# EasyEDA Pro project ProPrj_F1底板.1_2025-05-31.epro

# Schematic Schematic1

## Sheets
1 MPU6050: Board Name: Board1; Create Date: 2025-05-13; Page Name: MPU6050; Project Name: F1底板.1; Schematic Name: Schematic1; Update Date: 2025-05-19; Company: 嘉立创EDA; Page Size: A4; Version: V1.0
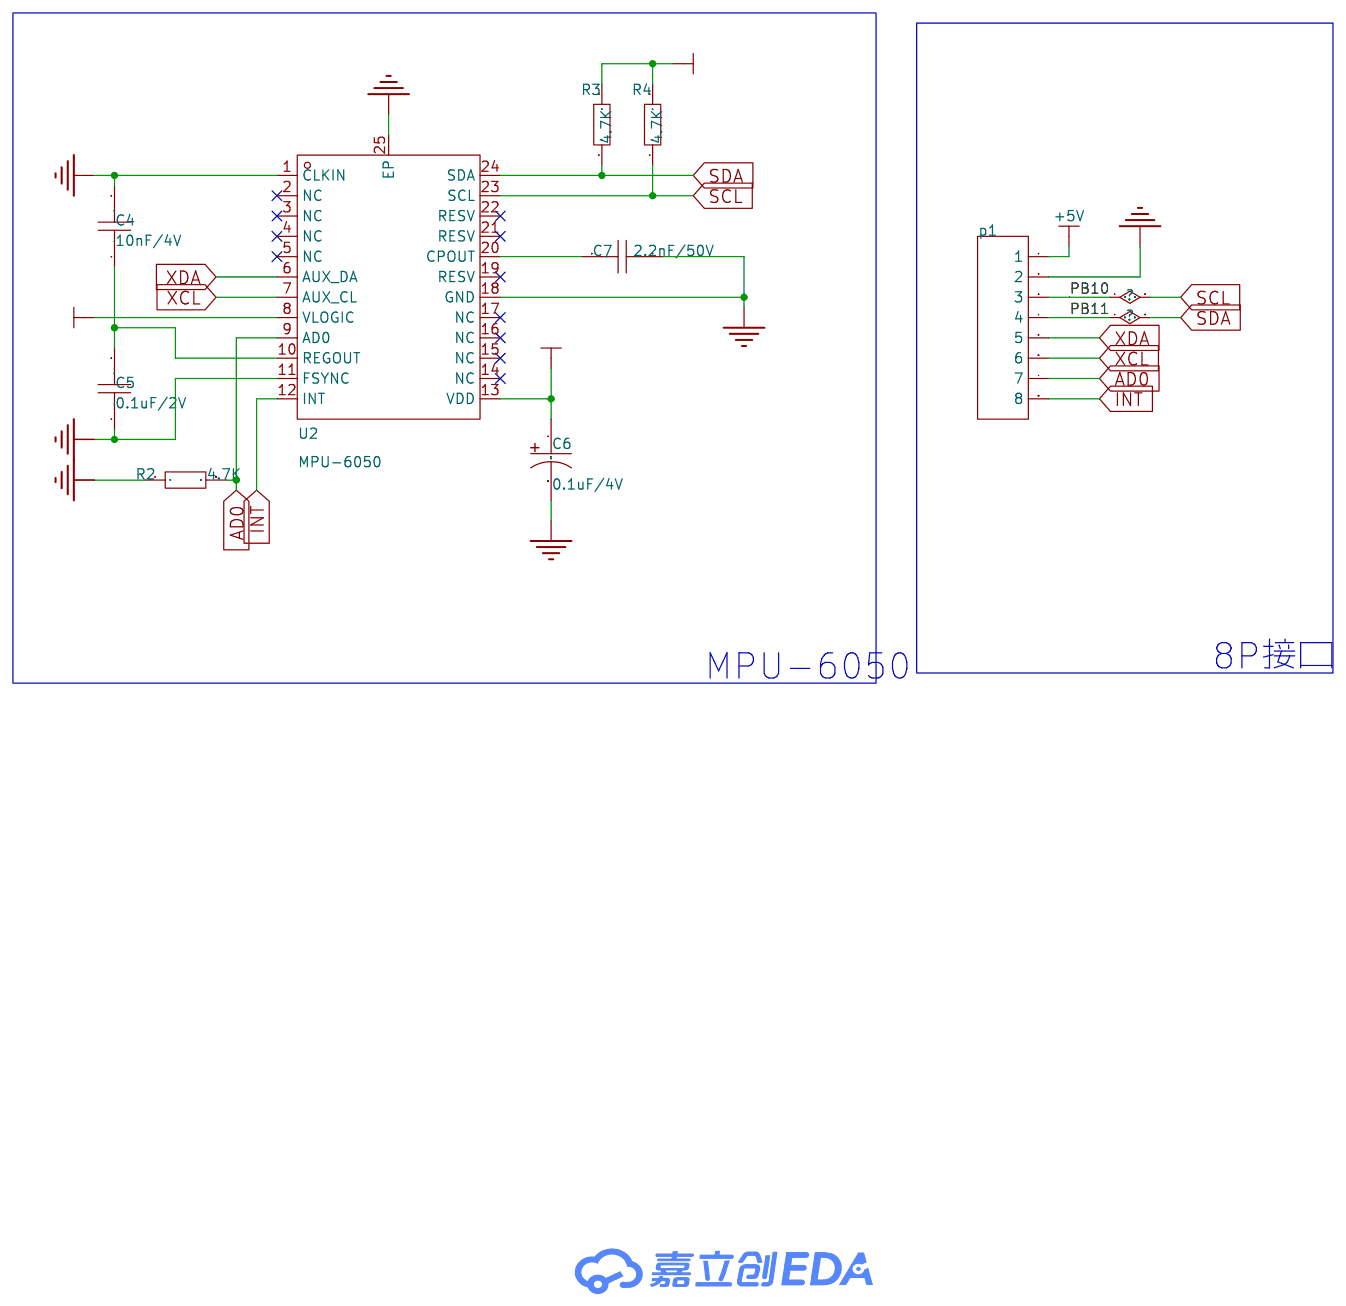
[diagram p0: MPU6050]
2 按键: Page Name: 按键; Update Date: 2025-05-13
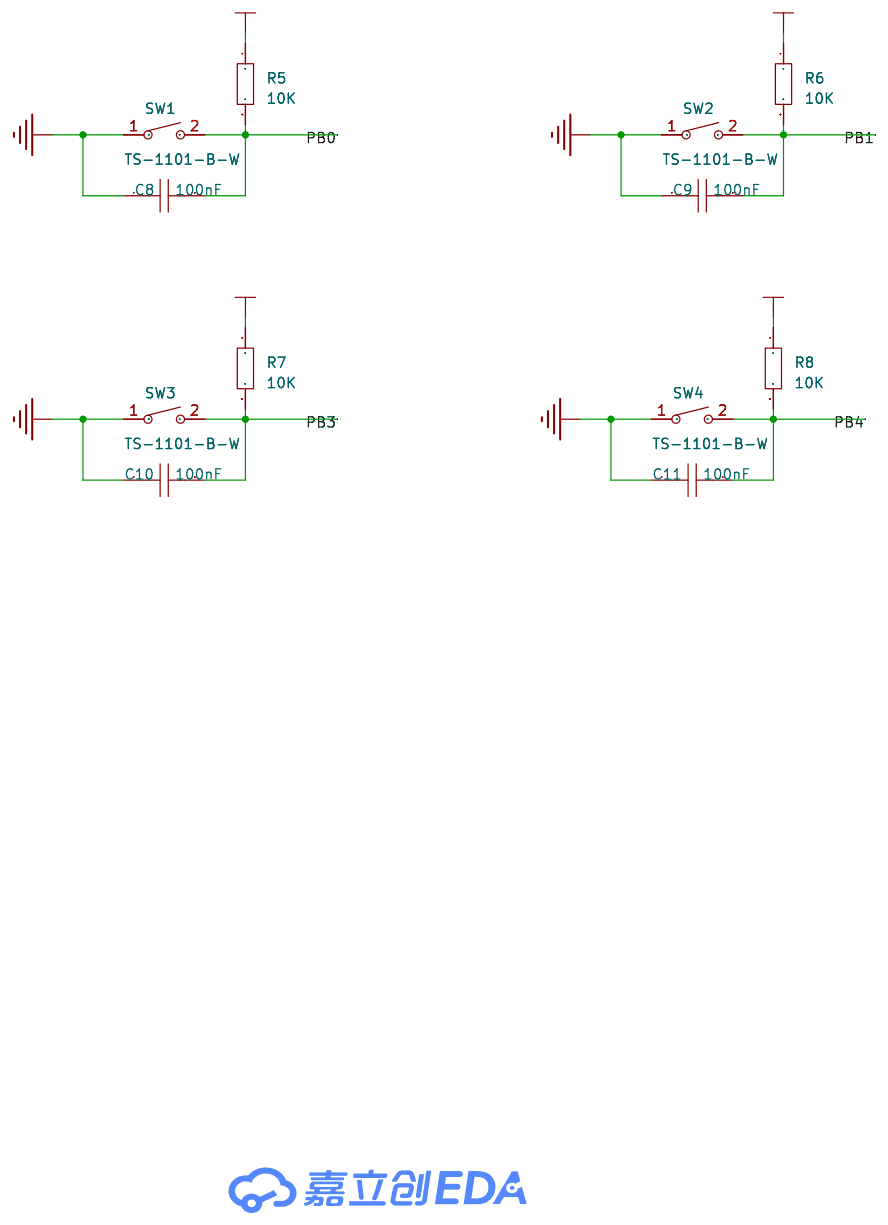
[diagram p1: 按键]
3 蜂鸣器: Page Name: 蜂鸣器; Update Date: 2025-05-13
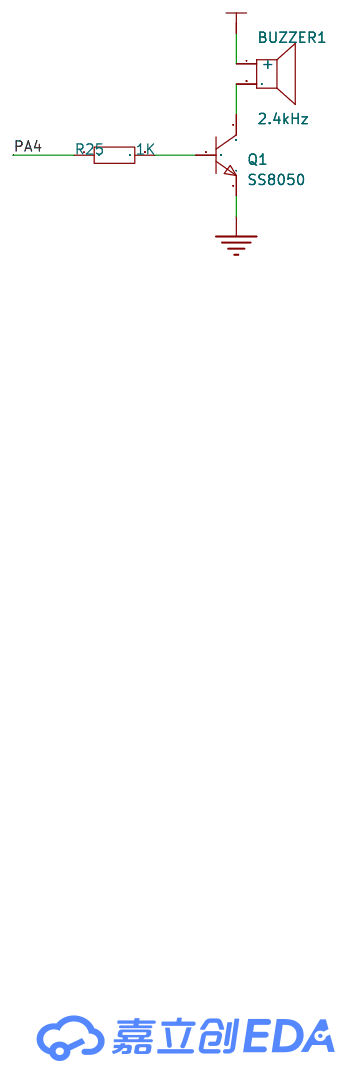
[diagram p2: 蜂鸣器]
4 TB6612驱动模块: Page Name: TB6612驱动模块
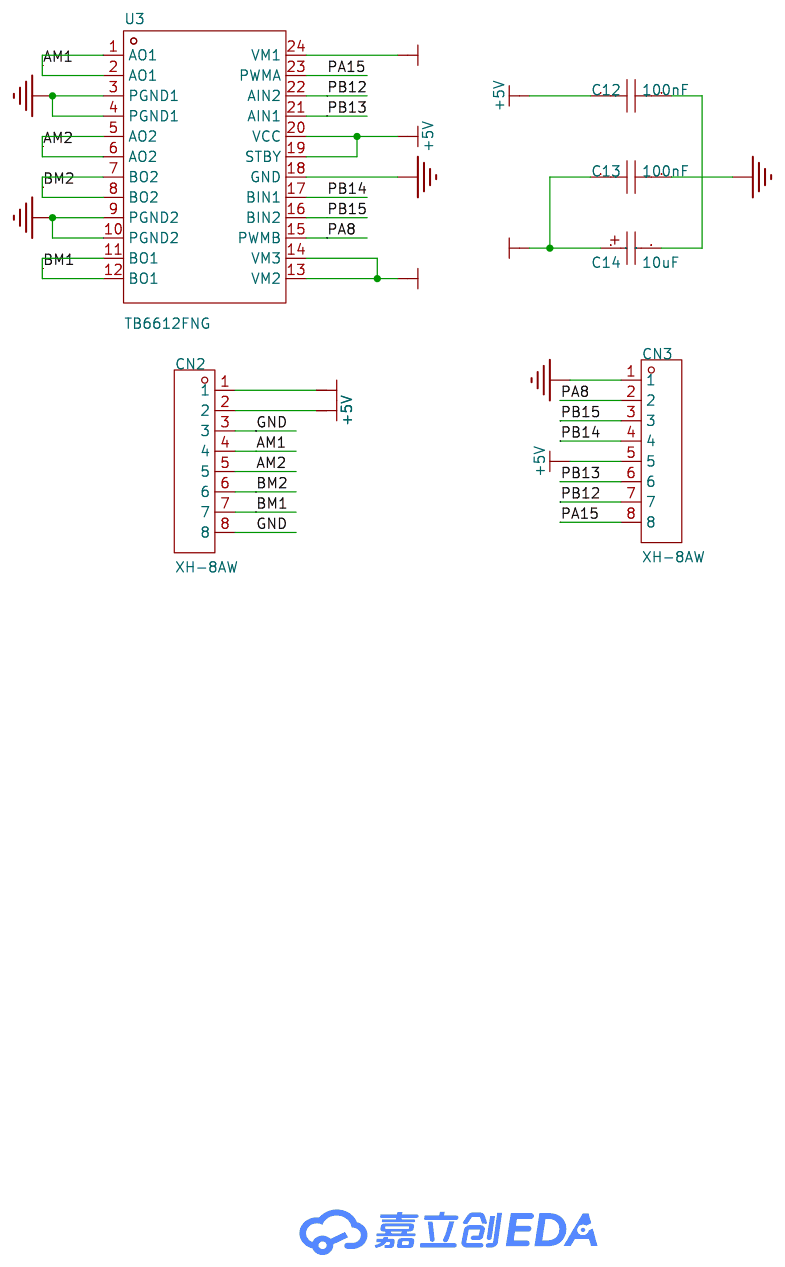
[diagram p3: TB6612驱动模块]
5 接口: Page Name: 接口; Update Date: 2025-05-21
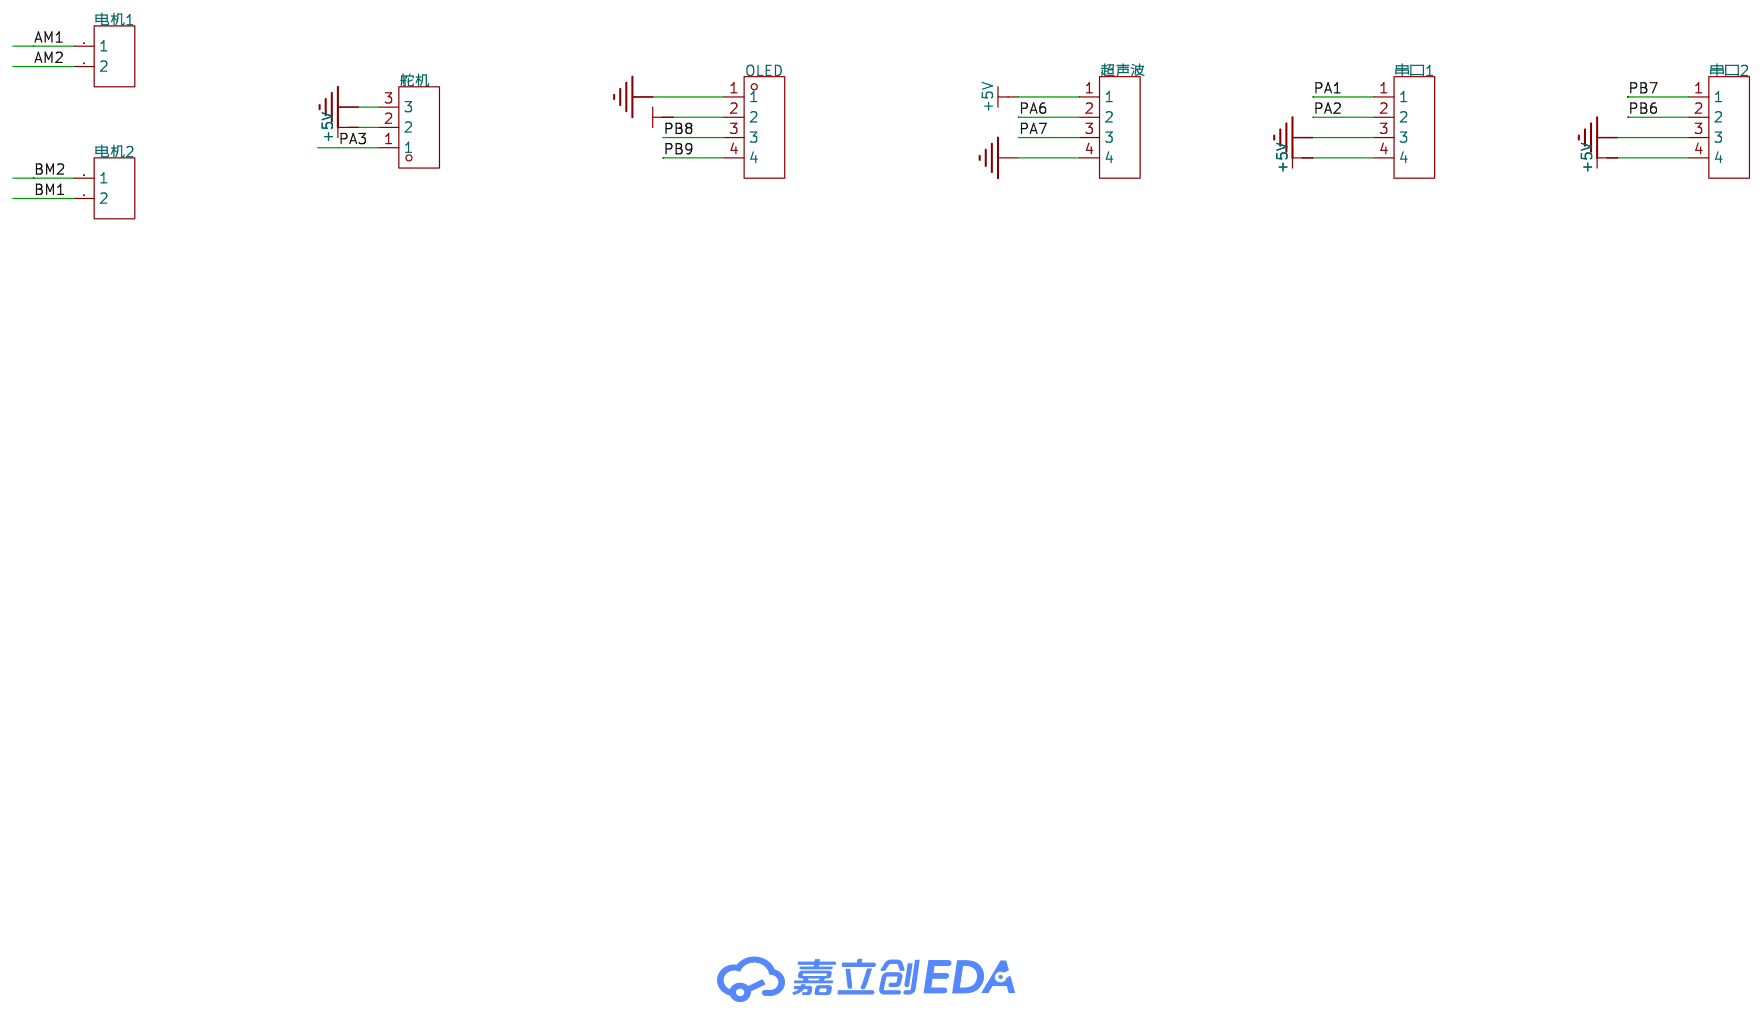
[diagram p4: 接口]
6 电源输入 输出: Page Name: 电源输入 输出
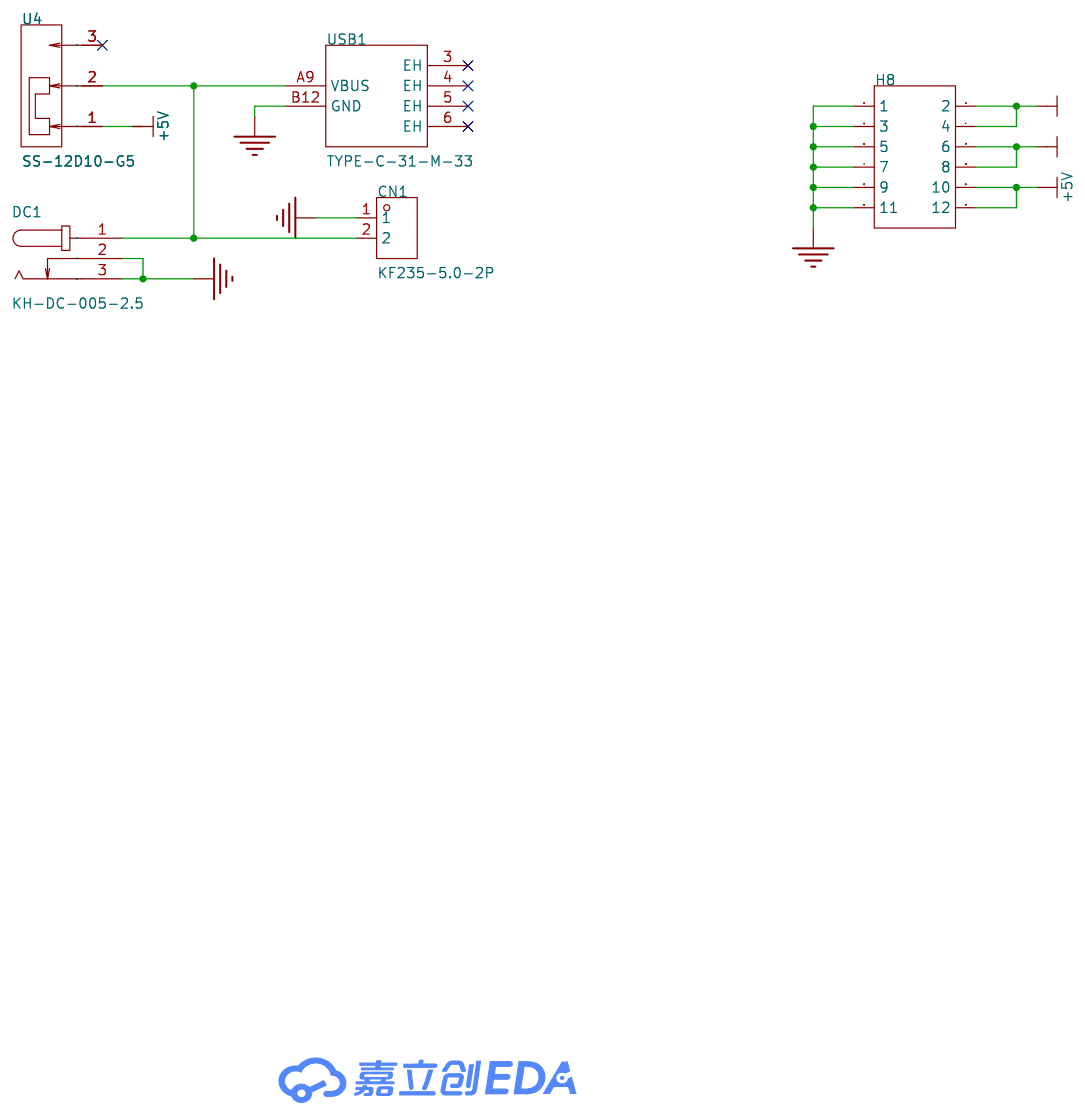
[diagram p5: 电源输入 输出]
7 升压 降压模块: Page Name: 升压 降压模块; Update Date: 2025-05-13
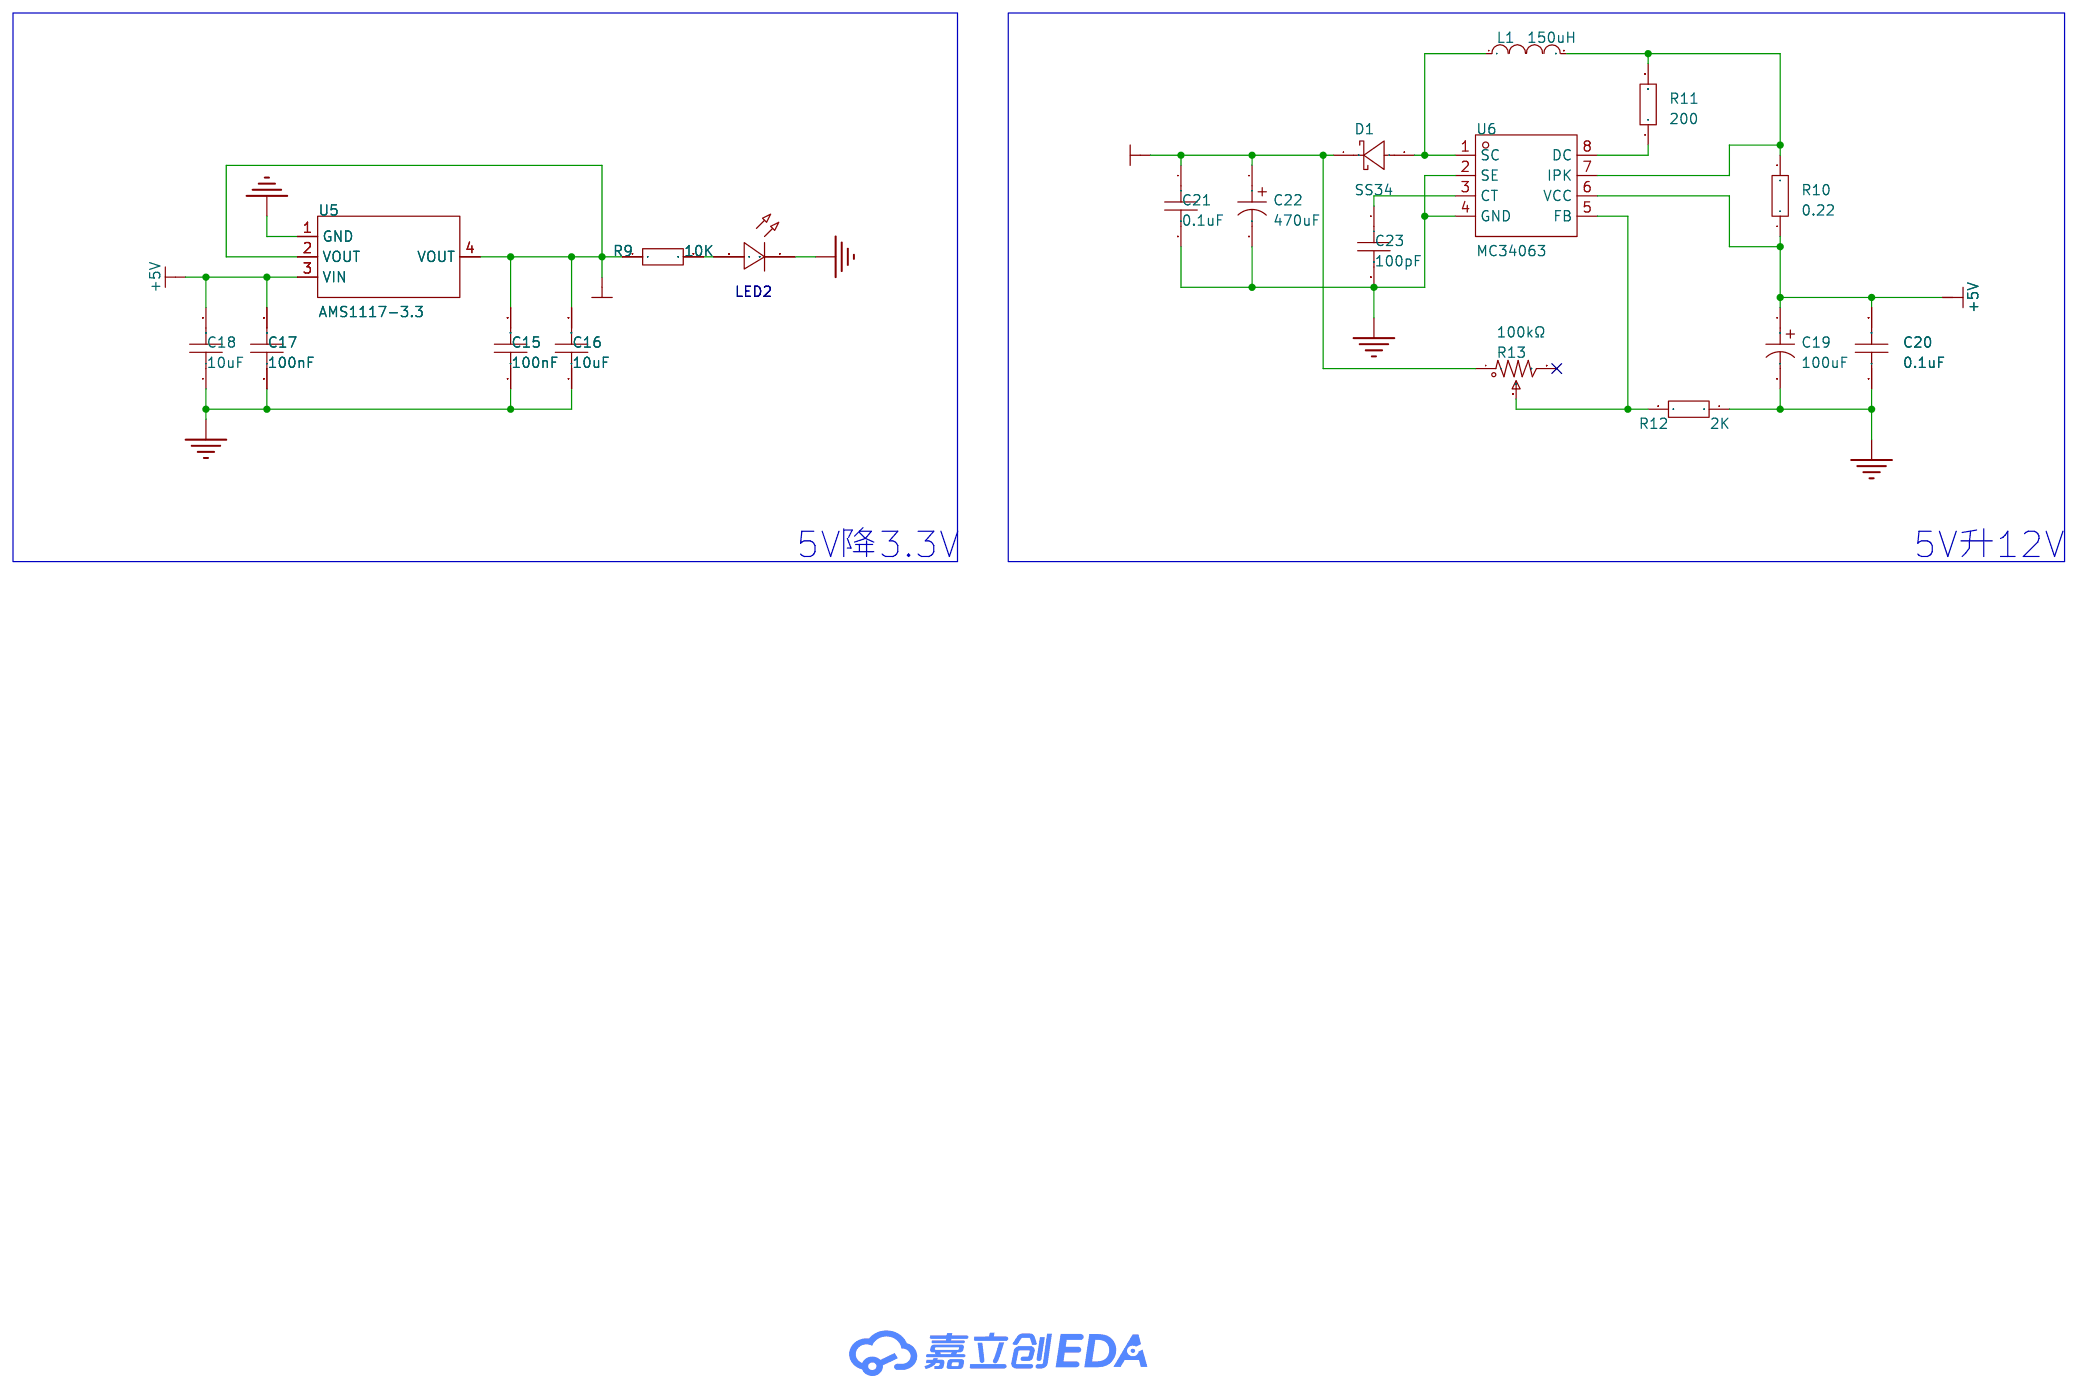
[diagram p6: 升压 降压模块]
8 蓝牙模块: Create Date: 2025-05-15; Page Name: 蓝牙模块; Update Date: 2025-05-15
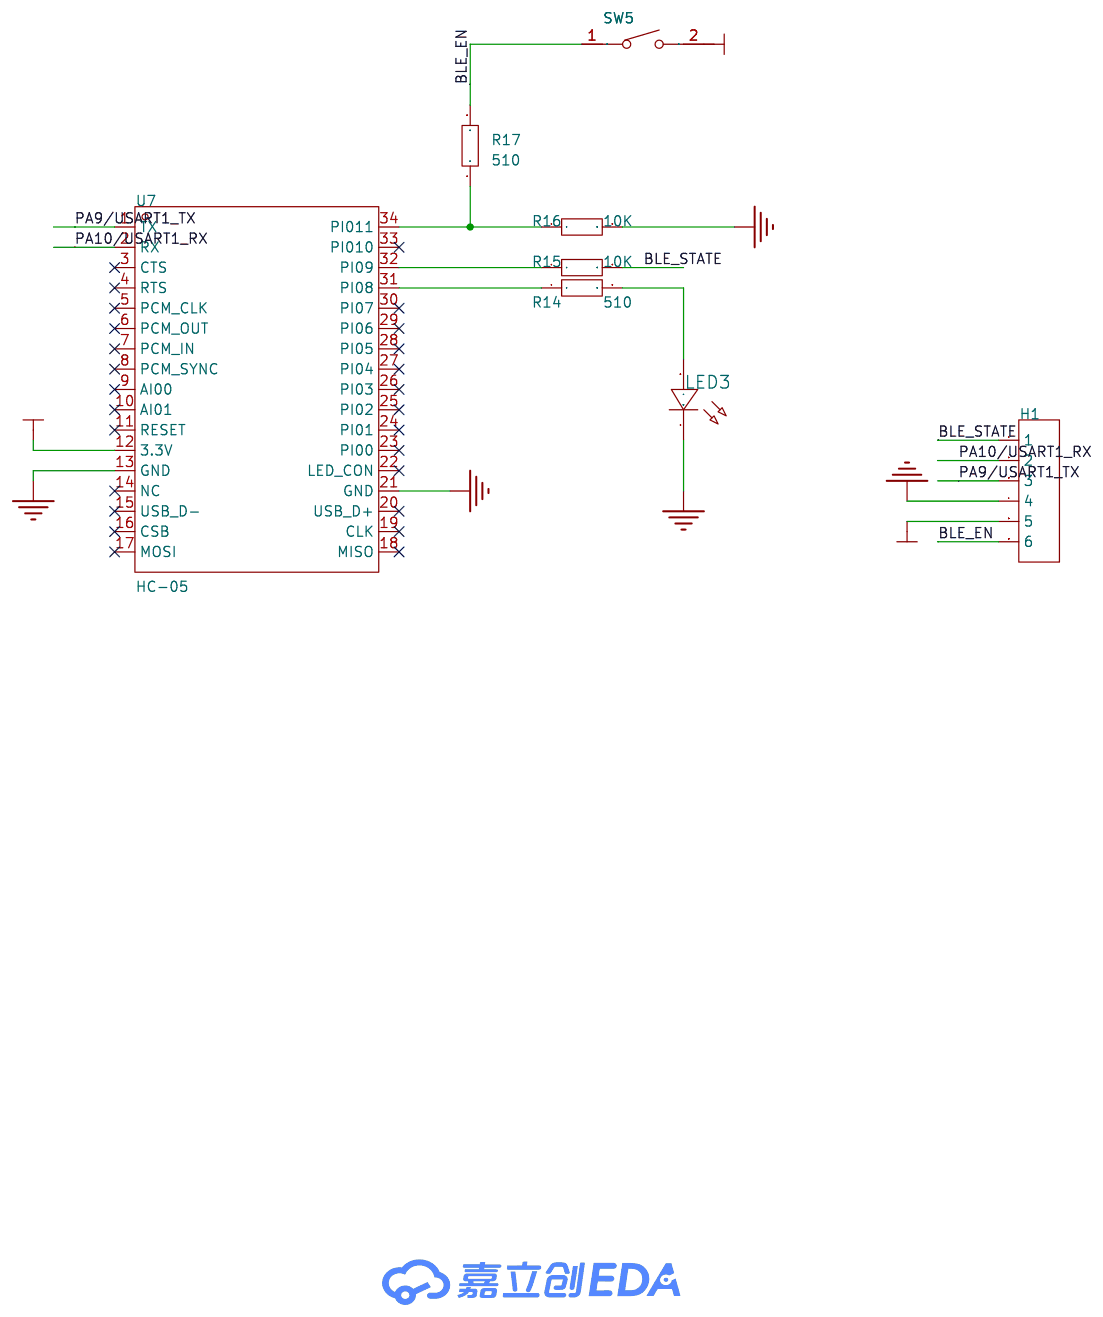
[diagram p7: 蓝牙模块]
9 STM32F103C8T6模块: Create Date: 2025-05-15; Page Name: STM32F103C8T6模块
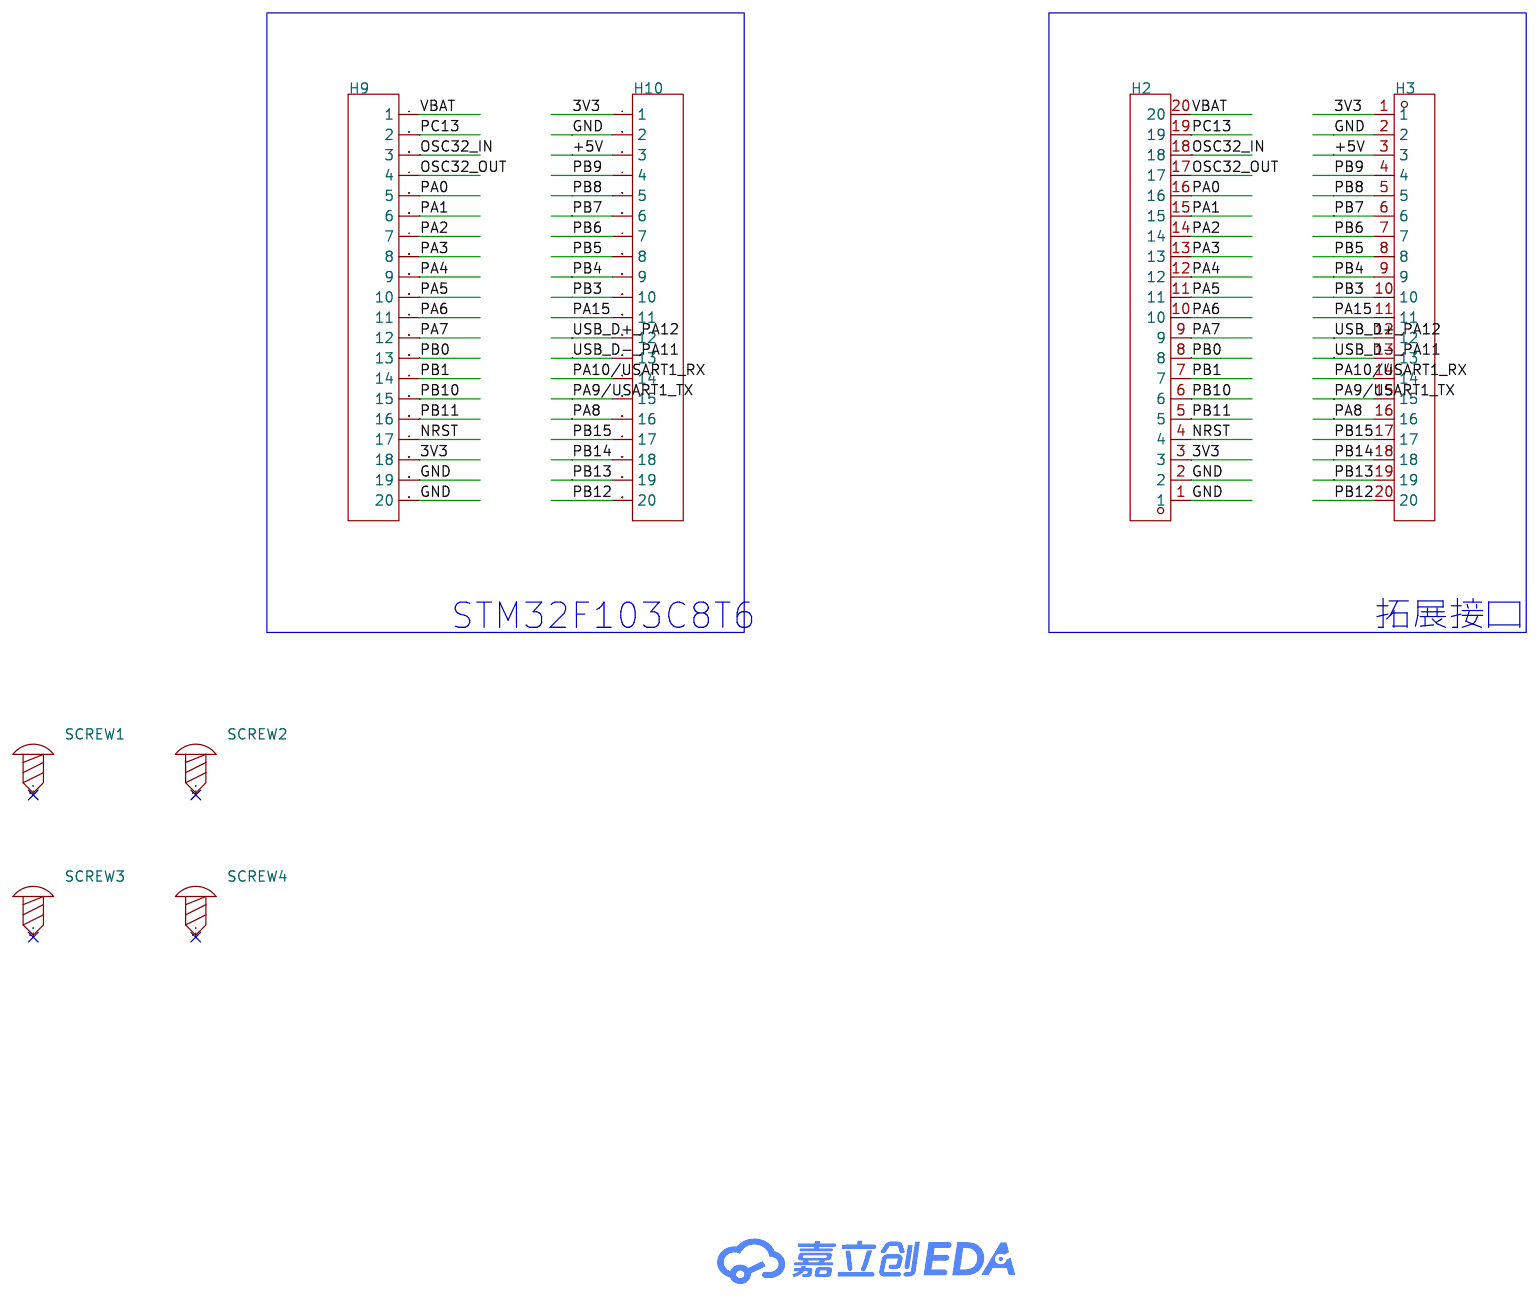
[diagram p8: STM32F103C8T6模块]
10 光敏: Create Date: 2025-05-15; Page Name: 光敏; Update Date: 2025-05-15
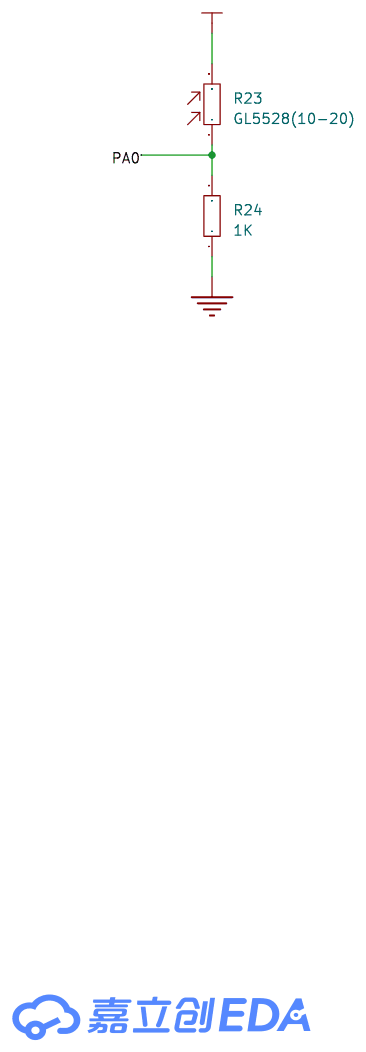
[diagram p9: 光敏]

## Parts
sheet MPU6050
C4  10nF/4V  [C0805]
C5  0.1uF/2V  [C0805]
C6  0.1uF/4V  [CAP-SMD_L3.2-W1.6]
C7  2.2nF/50V  [C0805]
p1  -  [HDR-TH_8P-P2.54-V-M]
R2  4.7K  [R0805]
R3  4.7K  [R0805]
R4  4.7K  [R0805]
U2  MPU-6050  [QFN-24_L4.0-W4.0-P0.50-BL-EP2.7]
sheet STM32F103C8T6模块
H2  -  [HDR-TH_20P-P2.54-V-M-1]
H3  -  [HDR-TH_20P-P2.54-V-M-1]
H9  -  [HDR-TH_20P-P2.54-V-F]
H10  -  [HDR-TH_20P-P2.54-V-F]
SCREW1  -  [M3螺丝]
SCREW2  -  [M3螺丝]
SCREW3  -  [M3螺丝]
SCREW4  -  [M3螺丝]
sheet TB6612驱动模块
C12  100nF  [C0805]
C13  100nF  [C0805]
C14  10uF  [CAP-SMD_L3.5-W2.8-R-RD]
CN2  XH-8AW  [CONN-TH_8P-P2.54_HCTL_XH-8AW_C2908617]
CN3  XH-8AW  [CONN-TH_8P-P2.54_HCTL_XH-8AW_C2908617]
U3  TB6612FNG  [SSOP-24_L8.3-W5.6-P0.65-LS7.6-BL]
sheet 光敏
R23  GL5528(10-20)  [RES-TH_L5.1-W4.3-P3.40-D0.5]
R24  1K  [R0805]
sheet 升压 降压模块
C15  100nF  [C0805]
C16  10uF  [C0805]
C17  100nF  [C0805]
C18  10uF  [C0805]
C19  100uF  [CAP-SMD_BD6.3-L6.6-W6.6-LS7.6-RD]
C20  0.1uF  [C0805]
C21  0.1uF  [C0805]
C22  470uF  [CAP-SMD_BD6.3-L6.6-W6.6-LS7.6-RD]
C23  100pF  [C0805]
D1  SS34  [SMA_L4.3-W2.5-LS5.0-RD]
L1  150uH  [IND-SMD_L7.0-W6.8]
LED2  -  [LED_0805]
R9  10K  [R0805]
R10  0.22  [R0805]
R11  200  [R0805]
R12  2K  [R0805]
R13  100kΩ  [RES-ADJ-TH_3P-L10.0-W10.0-P2.50-L]
U5  AMS1117-3.3  [SOT-223-3_L6.5-W3.4-P2.30-LS7.0-BR]
U6  MC34063  [SOIC-8_L5.0-W4.0-P1.27-LS6.0-BL]
sheet 按键
C8  100nF  [C0805]
C9  100nF  [C0805]
C10  100nF  [C0805]
C11  100nF  [C0805]
R5  10K  [R0805]
R6  10K  [R0805]
R7  10K  [R0805]
R8  10K  [R0805]
SW1  TS-1101-B-W  [KEY-SMD_2P-L6.0-W3.6-P7.4-LS8.0-L]
SW2  TS-1101-B-W  [KEY-SMD_2P-L6.0-W3.6-P7.4-LS8.0-L]
SW3  TS-1101-B-W  [KEY-SMD_2P-L6.0-W3.6-P7.4-LS8.0-L]
SW4  TS-1101-B-W  [KEY-SMD_2P-L6.0-W3.6-P7.4-LS8.0-L]
sheet 接口
OLED  -  [HDR-TH_4P-P2.54-V-F]
串口1  -  [HDR-TH_4P-P2.54-V-M]
串口2  -  [HDR-TH_4P-P2.54-V-M]
电机1  -  [HDR-TH_2P-P2.54-V-F]
电机2  -  [HDR-TH_2P-P2.54-V-F]
舵机  -  [HDR-TH_3P-P2.54-V-M]
超声波  -  [HDR-TH_4P-P2.54-V-M]
sheet 电源输入 输出
CN1  KF235-5.0-2P  [CONN-TH_P5.00_KF235-5.0-2P]
DC1  KH-DC-005-2.5  [DC-IN-TH_KH-DC-005-2.5]
H8  -  [HDR-TH_12P-P2.54-V-M-R2-C6-S2.54]
U4  SS-12D10-G5  [SW-TH_SS-12D10-G050]
USB1  TYPE-C-31-M-33  [USB-C-TH_TYPE-C-31-M-33]
sheet 蓝牙模块
H1  -  [HDR-TH_6P-P2.54-V-M-1]
LED3  -  [LED_0805]
R14  510  [R0805]
R15  10K  [R0805]
R16  10K  [R0805]
R17  510  [R0805]
SW5  TS-1088-AR02016  [SW-SMD_L3.9-W3.0-P4.45]
U7  HC-05  [BULETM-SMD_HC-05]
sheet 蜂鸣器
BUZZER1  2.4kHz  [BUZ-TH_BD12.0-P7.60-D0.6-FD]
Q1  SS8050  [SOT-23-3_L2.9-W1.3-P1.90-LS2.4-BR]
R25  1K  [R0805]

## Library data of the parts
C4 C5 C7-C13 C15-C18 C20 C21 C23 = CAP_0805: Supplier Footprint: 0805
C6 = TPSA106K016R1000: 容值:10uF;精度:±10%;额定电压:16V;等效串联电阻:1Ω@100kHz;; LCSC Part Name: 10uF ±10% 16V; Supplier Part: C282116; Manufacturer: Kyocera AVX; Supplier Footprint: CASE-A-3216-18(mm); Datasheet: https://atta.szlcsc.com/upload/public/pdf/source/20181129/C308928_3E6DA6FC57C95F0966ACBCD944046350.pdf; Supplier: LCSC; Tolerance: ±10%; Rated Voltage: 16V; Equivalent Series Resistance(ESR): 1Ω@100kHz; Operating Temperature: -55℃~+125℃
p1 = HDR-M_2.54_1x8P: Supplier Part: C124381; Supplier Footprint: 插件
R2-R12 R14-R17 R24 R25 = Res_0805: Supplier Footprint: 0805
U2 = MPU-6050: 传感器类型:加速度计陀螺仪;; Supplier Part: C24112; Manufacturer: TDK InvenSense(应美盛); Supplier Footprint: QFN-24-EP(4x4); JLCPCB Part Class: 扩展库; Datasheet: https://atta.szlcsc.com/upload/public/pdf/source/20140425/1457707046159.pdf; Supplier: LCSC; Sensor Type: 加速度计陀螺仪; Operating Temperature: -40℃~+85℃
H2 H3 = HDR-M_2.54_1x20P: 间距:2.54mm;总PIN位数:20;排数:1;插针结构:-;行距:-;安装类型:直插;圆针/方针:-;额定电流:-;额定电压:-;配合针长度:-;塑高:-;触头材质:黄铜;触头镀层:-;颜色:黑色;; Supplier Part: C50981; Supplier Footprint: 插件
H9 H10 = HDR-F_2.54_1x20P: Supplier Part: C50984; Supplier Footprint: 插件
SCREW1-SCREW4 = M3螺丝: Supplier Footprint: 插件
C14 = TAJB106K025RNJ: 容值:10uF;精度:±10%;额定电压:25V;等效串联电阻(ESR):2.5Ω@100kHz;; LCSC Part Name: 10uF ±10% 25V; Supplier Part: C7194; Manufacturer: Kyocera AVX; Supplier Footprint: CASE-B-3528-21(mm); JLCPCB Part Class: 扩展库; Supplier: LCSC; Tolerance: ±10%; Voltage Rating: 25V; Equivalent Series Resistance(ESR): 2.5Ω@100kHz; Operating Temperature: -55℃~+125℃
CN2 CN3 = XH-8AW: 插针结构:1x8P;间距:2.5mm;安装方式:弯插;参考系列:XH;总PIN数:8P;排数:1;每排PIN数:8;行距:-;额定电流:3A;触头材质:黄铜;触头镀层:锡;工作温度范围:-25℃~+85℃;; LCSC Part Name: 1x8P 间距:2.5mm 弯插 系列:XH; Supplier Part: C2908617; Manufacturer: HCTL(华灿天禄); Supplier Footprint: 弯插,P=2.5mm; Datasheet: https://atta.szlcsc.com/upload/public/pdf/source/20230711/B565BAF3B11666EF6B81B3605408F2BD.pdf; Supplier: LCSC; Pins Structure: 1x8P; Pitch: 2.5mm; Mounting Style: 弯插; Reference Series: XH; Number of Pins: 8P; Number of Rows: 1; Number of PINs Per Row: 8; Current Rating (Max): 3A; Contact Material: 黄铜; Contact Plating: 锡; Operating Temperature Range: -25℃~+85℃
U3 = TB6612FNG,C,8,EL: LCSC Part Name: 1A 有刷直流电机驱动芯片 5.5V; Supplier Part: C141517; Manufacturer: TOSHIBA(东芝); Supplier Footprint: SSOP-24; JLCPCB Part Class: 扩展库; Datasheet: https://atta.szlcsc.com/upload/public/pdf/source/20171128/C141517_15118625624231147036.pdf; Supplier: LCSC
R23 = GL5528(10-20)_C10081: 暗电阻:1MΩ;亮电阻@10Lux:10kΩ~20kΩ;光谱峰值(波长):540nm;; Supplier Part: C10081; Manufacturer: JCHL(晶创和立); Supplier Footprint: 插件,P=3.4mm; JLCPCB Part Class: 扩展库; Datasheet: https://atta.szlcsc.com/upload/public/pdf/source/20200417/C515010_C10502EF7F431E893A7F20DB83F527F0.pdf; Supplier: LCSC; Dark Resistance: 1MΩ; Cell Resistance @ Illuminance: 10kΩ~20kΩ; Voltage - Max: 150V; Wavelength - Peak: 540nm
C19 C22 = RVT1C471M0607: 容值:470uF;精度:±20%;额定电压:16V;纹波电流:185mA@120Hz;; LCSC Part Name: 470uF ±20% 16V; Supplier Part: C2977552; Manufacturer: ROQANG(容强); Supplier Footprint: SMD,D6.3xL7.7mm; JLCPCB Part Class: 扩展库; Datasheet: https://atta.szlcsc.com/upload/public/pdf/source/20220223/DD822675CC1DF2F0C06D5C2255C9C2D9.pdf; Supplier: LCSC; Tolerance: ±20%; Voltage Rating: 16V; Ripple Current: 185mA@120Hz; Diameter: 6.3mm; Height - Seated (Max): 7.7mm; Lifetime: 2000hrs@105℃; Operating Temperature: -40℃~+105℃
D1 = SS34_C727060: 二极管配置:独立式;正向压降(Vf):550mV@3A;直流反向耐压(Vr):40V;整流电流:3A;; LCSC Part Name: 电压:40V 电流:3A; Supplier Part: C727060; Manufacturer: TWGMC(台湾迪嘉); Supplier Footprint: SMA(DO-214AC); JLCPCB Part Class: 扩展库; Datasheet: https://atta.szlcsc.com/upload/public/pdf/source/20200828/C727059_6599B6CAC5F3238B9C33E46794659DBE.pdf; Supplier: LCSC; Diode Configuration: 独立式; Forward Voltage (Vf@If): 550mV@3A; Reverse Voltage (Vr): 40V; Rectified Current: 3A; Reverse Leakage Current (Ir): 500uA
L1 = SMRH74-220MT: 电感值:22uH;精度:±20%;额定电流:-;饱和电流(Isat):2.1A;类型:屏蔽电感;; LCSC Part Name: 22uH ±20% 2.1A; Supplier Part: C27442; Manufacturer: SXN(顺翔诺); Supplier Footprint: SMD; Datasheet: https://atta.szlcsc.com/upload/public/pdf/source/20210810/BDFBFE50B8A07C1FC066F2D9473ADCAE.pdf; Supplier: LCSC; Tolerance: ±20%; Saturation Current (Isat): 2.1A; DC Resistance (DCR): 110mΩ; Type: 屏蔽电感
LED2 = LED_0805-G: Supplier Footprint: 0805
R13 = 3296W-1-103: 阻值:10kΩ;精度:±10%;; LCSC Part Name: 10kΩ ±10%; Supplier Part: C118954; Manufacturer: BOCHEN(博晨); Supplier Footprint: 插件; JLCPCB Part Class: 扩展库; Datasheet: https://atta.szlcsc.com/upload/public/pdf/source/20171114/C118954_15106326646611117443.pdf; Supplier: LCSC; Tolerance: ±10%
U5 = AMS1117-3.3_C6186: 输出类型:固定;工作电压:-;输出电压:3.3V;输出电流:1A;电源纹波抑制比(PSRR):72dB@(120Hz);输出极性:正极;; LCSC Part Name: 输出3.3V 1A; Supplier Part: C6186; Manufacturer: AMS; Supplier Footprint: SOT-223; JLCPCB Part Class: 基础库; Datasheet: https://atta.szlcsc.com/upload/public/pdf/source/20180727/C6186_7A095716F0823C02F1997A905E26C086.pdf; Supplier: LCSC; Output Type: 固定; Output Voltage: 3.3V; Output Current: 1A; Power Supply Rejection Ratio (PSRR): 72dB@(120Hz); Voltage Dropout: 1.3V@(800mA); Features: 过流保护(OCP)；热关断(TSD); Output Configuration: 正极; Number of Outputs: 1
U6 = MC34063_C5349988: 功能类型:-;输出类型:-;工作电压:3V~40V;输出电压:-;输出电流:-;; LCSC Part Name: 1.3A升压/降压/反相开关稳压器; Supplier Part: C5349988; Manufacturer: HXY MOSFET(华轩阳电子); Supplier Footprint: SOP-8; JLCPCB Part Class: 扩展库; Datasheet: https://atta.szlcsc.com/upload/public/pdf/source/20231229/D1A87F39F2F1E3F68C55B6C50423EC0B.pdf; Supplier: LCSC; Input Voltage: 3V~40V; Operating Temperature: 0℃~+70℃; Synchronous Rectification: 否; Number of Outputs: 1; Topology: 升压式；降压式；反相式; Switch tube (built-in/external): 内置
SW1-SW4 = TS-1101-B-W_C500065: 电路结构:单刀单掷;按钮形状:矩形按钮;作用力:160gf;安装方式:立贴;开关长度:6mm;开关宽度:3.6mm;开关高度:2.5mm;带支架:不带;触点电流:50mA;额定电压(DC):12V;绝缘电阻:-;带灯:无;机械寿命:5万次;; LCSC Part Name: 6*3.6*2.5mm 立贴 轻触开关; Supplier Part: C500065; Manufacturer: XKB Connectivity(中国星坤); Supplier Footprint: SMD; JLCPCB Part Class: 扩展库; Datasheet: https://atta.szlcsc.com/upload/public/pdf/source/20211011/D0E0CAF534F7B19DDE4CE68748A25BD3.pdf; Supplier: LCSC; Circuit: 单刀单掷; Actuator Style: 矩形按钮; Operating Force: 160gf; Mounting Style: 立贴; Switch Length: 6mm; Switch Width: 3.6mm; Switch Height: 2.5mm; Strike Gundam: 不带; Contact Current: 50mA; Voltage Rating (DC): 12V; Actuator/Cap Color: 白色; With Lamp: 无; Mechanical Life: 5万次; Operating Temperature: -30℃~+85℃
OLED = HDR-F_2.54_1x4P: Supplier Part: C2718488; Supplier Footprint: 插件
串口1 串口2 超声波 = HDR-M_2.54_1x4P: Supplier Part: C492403; Supplier Footprint: 插件
电机1 电机2 = HDR-F_2.54_1x2P: Supplier Part: C49661; Supplier Footprint: 插件
舵机 = HDR-M_2.54_1x3P: Supplier Part: C2937625; Supplier Footprint: 插件
CN1 = KF235-5.0-2P: 间距:5mm;安装类型:-;总PIN数:2P;每排PIN数:2;额定电流:10A;额定电压:250V;线规 - AWG:14~20;线规 - 平方毫米:1.5;; LCSC Part Name: 5mm 每排P数:2; Supplier Part: C475172; Manufacturer: KEFA(科发); Supplier Footprint: 插件,P=5mm; JLCPCB Part Class: 扩展库; Datasheet: https://atta.szlcsc.com/upload/public/pdf/source/20230317/E5C145033BF834CD55C2642CB7ED7113.pdf; Supplier: LCSC; Pitch: 5mm; Number of Pins: 2P; Number of PINs Per Row: 2; Current Rating (Max): 10A; Voltage Rating (Max): 250V; Wire Gauge - AWG: 14~20; Wire Gauge - mm2: 1.5
DC1 = KH-DC-005-2.5: 连接器类型:DC电源插座;安装方式:弯插;触点内径:-;触点外径:6.4mm;额定电流:1A;额定电压:30V;工作温度范围:-25℃~+70℃;; LCSC Part Name: DC电源插座 外径:6.4mm; Supplier Part: C2847170; Manufacturer: kinghelm(金航标); Supplier Footprint: 插件; JLCPCB Part Class: 扩展库; Datasheet: https://atta.szlcsc.com/upload/public/pdf/source/20210716/C2847170_7F0110A0BEDEE81C68B76DF87AC8DA16.pdf; Supplier: LCSC; Connector Type: DC电源插座; Mounting Style: 弯插; Outside Contact Diameter: 6.4mm; Current Rating (Max): 1A; Voltage Rating (Max): 30V; Operating Temperature Range: -25℃~+70℃
H8 = HDR-F_2.54_2x6
U4 = SS-12D10-G5: 电路结构:单刀双掷;安装方式:直插;开关颜色:黑色;机械寿命:-;; LCSC Part Name: 插件大电流拨动开关; Supplier Part: C2998777; Manufacturer: DEALON(德艺隆); Supplier Footprint: 插件; JLCPCB Part Class: 扩展库; Datasheet: https://atta.szlcsc.com/upload/public/pdf/source/20220428/E10CB334ACBAF32CF4AF8D87DA871CD3.pdf; Supplier: LCSC; Circuit: 单刀双掷; Actuator Style: 矩形柱状; Pin Style: PC引脚; Switch Length: 12.7mm; Switch Width: 6.7mm; Switch Height: 11.3mm; Mounting Style: 直插; Actuator Color: 黑色
USB1 = TYPE-C-31-M-33: 连接器类型:Type-C;标准:-;公母:母;端口数量:1;触点数量:2P;安装方式:弯插;额定电流 - 电源:3A;工作温度范围:-30℃~+80℃;; LCSC Part Name: Type-C 母 弯插; Supplier Part: C2848624; Manufacturer: 韩国韩荣; Supplier Footprint: 插件; JLCPCB Part Class: 扩展库; Datasheet: https://atta.szlcsc.com/upload/public/pdf/source/20231031/D475E686242BF2F6A19F76A577F86FCC.pdf; Supplier: LCSC; Connector Type: Type-C; Gender: 母; Number of Ports: 1; Number of Contacts: 2P; Mounting Style: 弯插; Current Rating - Power (Max): 3A; Operating Temperature Range: -30℃~+80℃
H1 = HDR-M_2.54_1x6P: Supplier Part: C37208; Supplier Footprint: 插件
LED3 = LED_0805-R: Supplier Footprint: 0805
SW5 = TS-1088-AR02016: 电路结构:单刀单掷;按钮形状:圆形按钮;作用力:160gf;安装方式:立贴;开关长度:4mm;开关宽度:3mm;开关高度:2mm;带支架:不带;触点电流:50mA;额定电压(DC):12V;绝缘电阻:100MΩ;机械寿命:10万次;; LCSC Part Name: 4*3*2mm 立贴 轻触开关; Supplier Part: C720477; Manufacturer: XUNPU(讯普); Supplier Footprint: SMD; JLCPCB Part Class: 扩展库; Datasheet: https://atta.szlcsc.com/upload/public/pdf/source/20200810/C720475_60D09DD6C54279ADDB2DC25100F1CC11.pdf; Supplier: LCSC; Circuit: 单刀单掷; Actuator Style: 圆形按钮; Operating Force: 160gf; Mounting Style: 立贴; Switch Length: 4mm; Switch Width: 3mm; Switch Height: 2mm; Strike Gundam: 不带; Contact Current: 50mA; Voltage Rating (DC): 12V; Insulation Resistance: 100MΩ; Actuator/Cap Color: 黑色; Pin Style: SMD接片; Mechanical Life: 10万次; Operating Temperature: -30℃~+80℃
U7 = HC-05: Supplier Part: C9900001063; Supplier Footprint: SMD-34_13.0X27.0X1.50P; JLCPCB Part Class: 扩展库; Supplier: LCSC
BUZZER1 = TMB12A05_C96093: 驱动方式:有源(内含驱动线路);构造类型:电磁式;额定电压:-;频率:2.4kHz;声压(SPL):85dB;; LCSC Part Name: TMB12A05; Supplier Part: C96093; Manufacturer: 华能; Manufacturer Part: TMB12A05; Supplier Footprint: 插件,D=12mm; JLCPCB Part Class: 扩展库; Datasheet: https://atta.szlcsc.com/upload/public/pdf/source/20241025/8A17FE04D767D19A35A06DEF9A82AB1E.pdf; Supplier: LCSC; Driver Circuitry: 有源(内含驱动线路); Technology: 电磁式; Voltage - Supply: 4V~8V; Sound Pressure Level(SPL): 85dB; Diameter(φD): 12mm; Height: 9.8mm
Q1 = SS8050(RANGE:200-350)_C2150: 晶体管类型:NPN;集电极电流(Ic):1.5A;集射极击穿电压(Vceo):25V;功率(Pd):300mW;直流电流增益(hFE@Ic,Vce):200@800mA,1V;; LCSC Part Name: NPN 电流:1.5A 耐压:25V hfe=200~350; Supplier Part: C2150; Manufacturer: CJ(江苏长电/长晶); Supplier Footprint: SOT-23; JLCPCB Part Class: 基础库; Datasheet: https://atta.szlcsc.com/upload/public/pdf/source/20230322/AEE86F4B043774EFF80CAEA14A37D9E9.pdf; Supplier: LCSC; Transistor Type: NPN; Collector Current (Ic): 1.5A; Collector-Emitter Breakdown Voltage (Vceo): 25V; Power Dissipation (Pd): 300mW; DC Current Gain (hFE@Ic,Vce): 200@800mA,1V; Transition Frequency (fT): 100MHz; Collector Cut-Off Current (Icbo): 100nA; Collector-Emitter Saturation Voltage (VCE(sat)@Ic,Ib): 500mV@800mA,80mA; Operating Temperature: -55℃~+150℃

## Nets
3V3: BUZZER1.1(+) C6.1 C15.2 C16.2 H1.5 H2.3 H3.1 H8.6 H8.8 H9.18 H10.1 OLED.2 R3.2 R4.2 R5.1 R6.1 R7.1 R8.1 R9.1 R23.2 SW5.2 U2.8(VLOGIC) U2.13(VDD) U5.2(VOUT) U5.4(VOUT) U7.12(3.3V)
12V: C13.1 C14.1 C21.1 C22.1 CN2.1 D1.1(C) H8.2 H8.4 R13.1 U3.13(VM2) U3.14(VM3) U3.24(VM1)
+5V: C12.1 C17.2 C18.2 C19.1 C20.2 CN2.2 CN3.5 H3.3 H8.10 H8.12 H10.3 p1.1 R10.1 U3.19(STBY) U3.20(VCC) U4.1 U5.3(VIN) U6.6(VCC) 串口1.4 串口2.4 舵机.2 超声波.1
GND: C4.2 C5.1 C6.2 C7.1 C8.1 C9.1 C10.1 C11.1 C13.2 C15.1 C16.1 C17.1 C18.1 C19.2 C20.1 C21.2 C22.2 C23.2 CN1.1 CN2.3 CN2.8 CN3.1 DC1.2 DC1.3 H1.4 H2.1 H2.2 H3.2 H8.1 H8.3 H8.5 H8.7 H8.9 H8.11 H9.19 H9.20 H10.2 LED2.1(C) LED3.1(C) OLED.1 p1.2 Q1.2(E) R2.1 R12.1 R16.2 R24.1 SW1.1 SW2.1 SW3.1 SW4.1 U2.1(CLKIN) U2.11(FSYNC) U2.18(GND) U2.25(EP) U3.3(PGND1) U3.4(PGND1) U3.9(PGND2) U3.10(PGND2) U3.18(GND) U5.1(GND) U6.2(SE) U6.4(GND) U7.13(GND) U7.21(GND) USB1.B12(GND) 串口1.3 串口2.3 舵机.3 超声波.4
VBAT: H2.20 H9.1
AD0: p1.7 R2.2 U2.9(AD0)
AM1: CN2.4 U3.1(AO1) U3.2(AO1) 电机1.1
AM2: CN2.5 U3.5(AO2) U3.6(AO2) 电机1.2
BLE_EN: H1.6 R17.2 SW5.1
BLE_STATE: H1.1 R15.2
BM1: CN2.7 U3.11(BO1) U3.12(BO1) 电机2.2
BM2: CN2.6 U3.7(BO2) U3.8(BO2) 电机2.1
INT: p1.8 U2.12(INT)
NRST: H2.4 H9.17
OSC32_IN: H2.18 H9.3
OSC32_OUT: H2.17 H9.4
PA0: H2.16 H9.5 R23.1 R24.2
PA1: H2.15 H9.6 串口1.1
PA2: H2.14 H9.7 串口1.2
PA3: H2.13 H9.8 舵机.1
PA4: H2.12 H9.9 R25.1
PA5: H2.11 H9.10
PA6: H2.10 H9.11 超声波.2
PA7: H2.9 H9.12 超声波.3
PA8: CN3.2 H3.16 H10.16 U3.15(PWMB)
PA9/USART1_TX: H1.3 H3.15 H10.15 U7.1(TX)
PA10/USART1_RX: H1.2 H3.14 H10.14 U7.2(RX)
PA15: CN3.8 H3.11 H10.11 U3.23(PWMA)
PB0: C8.2 H2.8 H9.13 R5.2 SW1.2
PB1: C9.2 H2.7 H9.14 R6.2 SW2.2
PB3: C10.2 H3.10 H10.10 R7.2 SW3.2
PB4: C11.2 H3.9 H10.9 R8.2 SW4.2
PB5: H3.8 H10.8
PB6: H3.7 H10.7 串口2.2
PB7: H3.6 H10.6 串口2.1
PB8: H3.5 H10.5 OLED.3
PB9: H3.4 H10.4 OLED.4
PB10: H2.6 H9.15 p1.3 R4.1 U2.23(SCL)
PB11: H2.5 H9.16 p1.4 R3.1 U2.24(SDA)
PB12: CN3.7 H3.20 H10.20 U3.22(AIN2)
PB13: CN3.6 H3.19 H10.19 U3.21(AIN1)
PB14: CN3.4 H3.18 H10.18 U3.17(BIN1)
PB15: CN3.3 H3.17 H10.17 U3.16(BIN2)
PC13: H2.19 H9.2
USB_D+_PA12: H3.12 H10.12
USB_D-_PA11: H3.13 H10.13
XCL: p1.6 U2.7(AUX_CL)
XDA: p1.5 U2.6(AUX_DA)
$1N1884: C4.1 C5.2 U2.10(REGOUT)
$1N2034: C7.2 U2.20(CPOUT)
$3N336: BUZZER1.2 Q1.3(C)
$3N347: Q1.1(B) R25.2
$4N708: C12.2 C14.2
$6N494: CN1.2 DC1.1 U4.2 USB1.A9(VBUS)
$7N512: LED2.2(A) R9.2
$7N1414: L1.2 R10.2 R11.2 U6.7(IPK)
$7N1427: R11.1 U6.8(DC)
$7N1439: D1.2(A) L1.1 U6.1(SC)
$7N1530: C23.1 U6.3(CT)
$7N1822: R12.2 R13.2 U6.5(FB)
$8N873: R16.1 R17.1 U7.34(PI011)
$8N886: R15.1 U7.32(PI09)
$8N895: R14.1 U7.31(PI08)
$8N949: LED3.2(A) R14.2

Not connected (* = marked no-connect by the designer): R13 3*; SCREW1 1*; SCREW2 1*; SCREW3 1*; SCREW4 1*; U2 2(NC)* 3(NC)* 4(NC)* 5(NC)* 14(NC)* 15(NC)* 16(NC)* 17(NC)* 19(RESV)* 21(RESV)* 22(RESV)*; U4 3*; U7 3(CTS)* 4(RTS)* 5(PCM_CLK)* 6(PCM_OUT)* 7(PCM_IN)* 8(PCM_SYNC)* 9(AI00)* 10(AI01)* 11(RESET)* 14(NC)* 15(USB_D-)* 16(CSB)* 17(MOSI)* 18(MISO)* 19(CLK)* 20(USB_D+)* 22(LED_CON)* 23(PI00)* 24(PI01)* 25(PI02)* 26(PI03)* 27(PI04)* 28(PI05)* 29(PI06)* 30(PI07)* 33(PI010)*; USB1 3(EH)* 4(EH)* 5(EH)* 6(EH)*

## Notes on the sheets
sheet 1
- MPU-6050
- 8P接口
sheet 7
- 5V降3.3V
- 5V升12V
sheet 9
- STM32F103C8T6
- 拓展接口

# Board PCB1
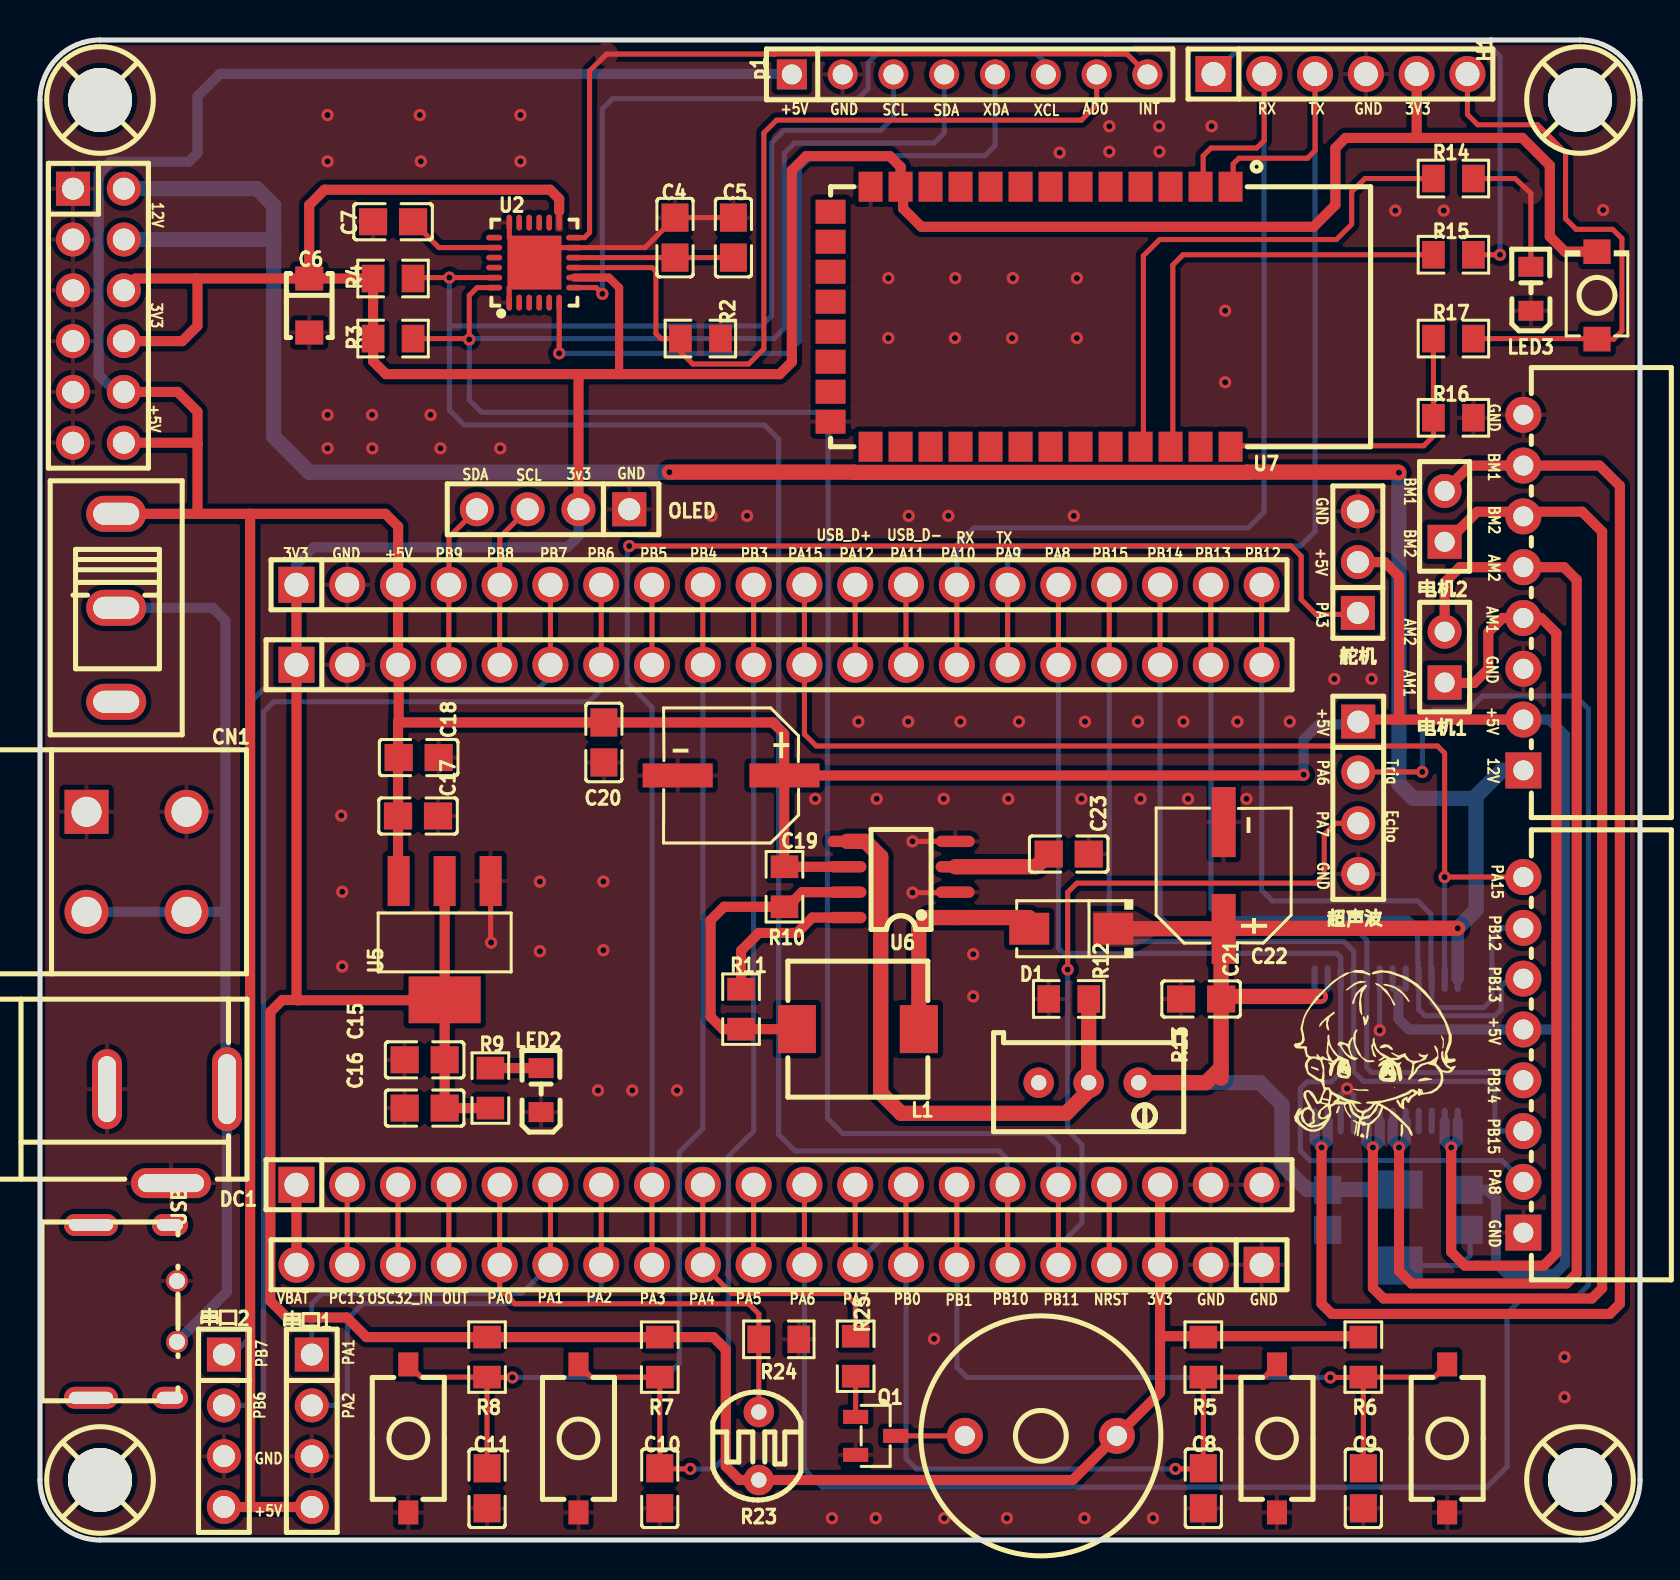
[diagram p10: board, top side]
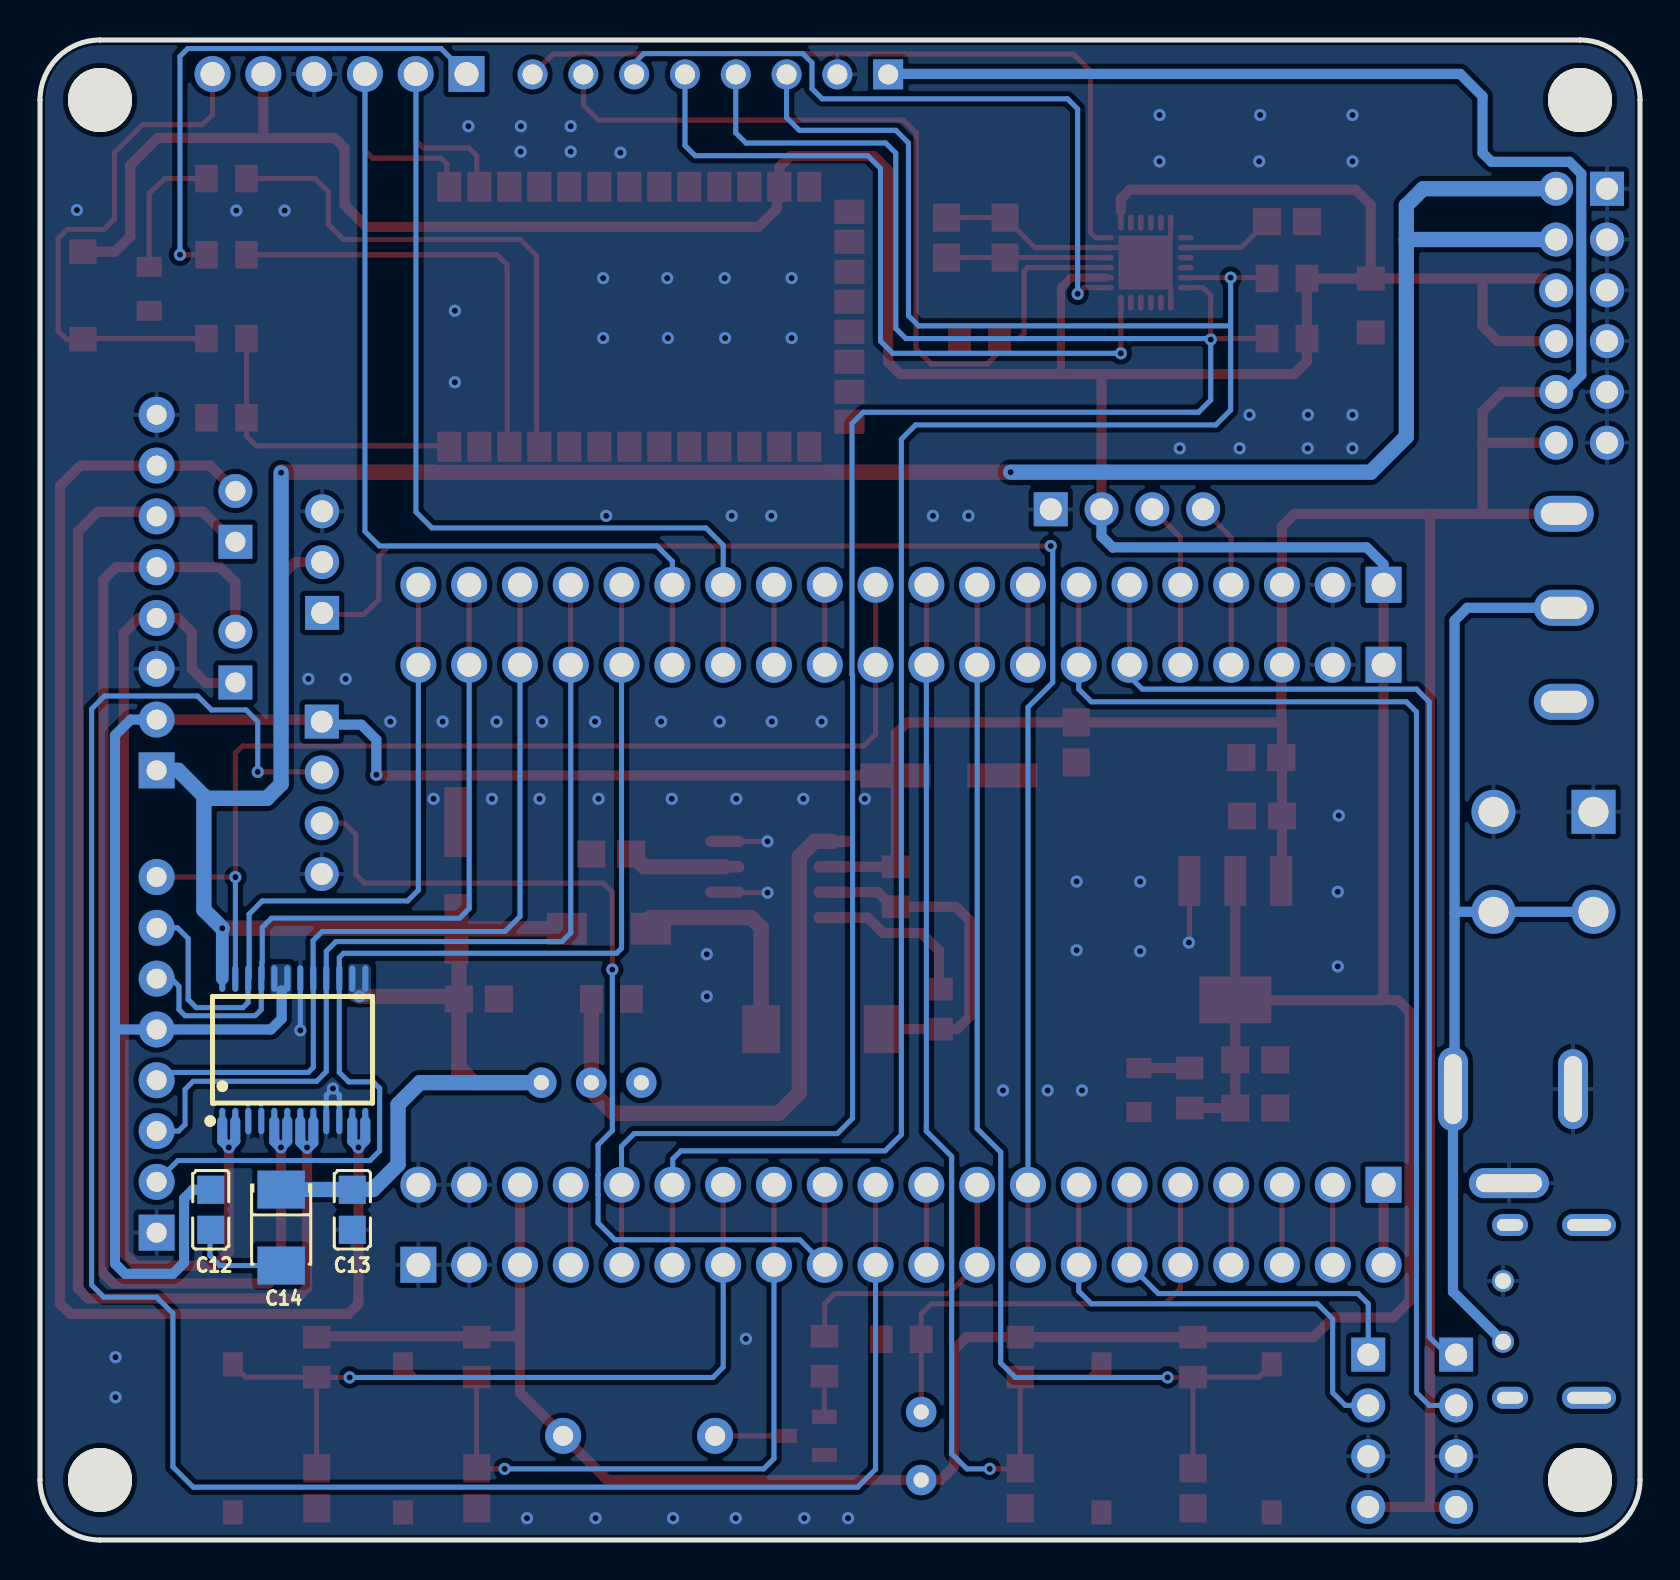
[diagram p11: board, bottom side, seen from below]

Outline 80 x 75 mm; copper layers: Top Layer, Bottom Layer. Coordinates in mm from the lower left corner of the outline.
Outline path: 0,72 0,3 arc(0.88,0.88) 3,0 77,0 arc(79.12,0.88) 80,3 80,72 arc(79.12,74.12) 77,75 3,75 arc(0.88,74.12) 0,72
Stack: Top Layer 0.035mm / Dielectric1 1.51mm FR4 er 4.5 / Bottom Layer 0.035mm

## Design rules (mm)
template: JLCPCB Capability(Two Layers Board)
spacing copperThickness1oz (default): track to track 0.102, other pairs 0.152 to 0.3
spacing copperThickness2oz: track to track 0.203, other pairs 0.152 to 0.3
track width copperThickness1oz (default): min 0.127, default 0.254, max 2.54
track width copperThickness2oz: min 0.203, default 0.254, max 2.54
differential pair differentialPair (default): width min 0.127, default 0.254, max 2.54; gap min 0.152, default 0.152
via viaSize (default): diameter min 0.5, default 0.61, max 10; hole min 0.3, default 0.305, max 6.3

## Placement (name value [footprint] x y rotation side)
BUZZER1  2.4kHz  [BUZ-TH_BD12.0-P7.60-D0.6-FD]  50.04 5.21 180 top
C4  10nF/4V  [C0805]  31.75 65.12 90 top
C5  0.1uF/2V  [C0805]  34.67 65.12 270 top
C6  0.1uF/4V  [CAP-SMD_L3.2-W1.6]  13.46 61.72 270 top
C7  2.2nF/50V  [C0805]  17.65 65.91 0 top
C8  100nF  [C0805]  58.17 2.59 90 top
C9  100nF  [C0805]  66.17 2.59 90 top
C10  100nF  [C0805]  30.99 2.59 90 top
C11  100nF  [C0805]  22.35 2.59 90 top
C12  100nF  [C0805]  71.46 16.51 270 bottom
C13  100nF  [C0805]  64.38 16.51 270 bottom
C14  10uF  [CAP-SMD_L3.5-W2.8-R-RD]  67.94 15.62 90 bottom
C15  100nF  [C0805]  19.23 24.01 0 top
C16  10uF  [C0805]  19.23 21.6 0 top
C17  100nF  [C0805]  18.9 36.2 180 top
C18  10uF  [C0805]  18.93 39.12 180 top
C19  100uF  [CAP-SMD_BD6.3-L6.6-W6.6-LS7.6-RD]  34.55 38.23 180 top
C20  0.1uF  [C0805]  28.19 39.88 90 top
C21  0.1uF  [C0805]  58.06 27.05 180 top
C22  470uF  [CAP-SMD_BD6.3-L6.6-W6.6-LS7.6-RD]  59.18 33.22 90 top
C23  100pF  [C0805]  51.44 34.3 0 top
CN1  KF235-5.0-2P  [CONN-TH_P5.00_KF235-5.0-2P]  4.83 33.91 270 top
CN2  XH-8AW  [CONN-TH_8P-P2.54_HCTL_XH-8AW_C2908617]  74.17 47.37 90 top
CN3  XH-8AW  [CONN-TH_8P-P2.54_HCTL_XH-8AW_C2908617]  74.17 24.26 90 top
D1  SS34  [SMA_L4.3-W2.5-LS5.0-RD]  51.56 30.56 180 top
DC1  KH-DC-005-2.5  [DC-IN-TH_KH-DC-005-2.5]  6.35 20.19 0 top
H1  -  [HDR-TH_6P-P2.54-V-M-1]  65.02 73.3 0 top
H2  -  [HDR-TH_20P-P2.54-V-M-1]  36.95 13.76 180 top
H3  -  [HDR-TH_20P-P2.54-V-M-1]  36.95 47.76 0 top
H8  -  [HDR-TH_12P-P2.54-V-M-R2-C6-S2.54]  2.92 61.21 270 top
H9  -  [HDR-TH_20P-P2.54-V-F]  36.95 17.76 0 top
H10  -  [HDR-TH_20P-P2.54-V-F]  36.95 43.76 0 top
L1  150uH  [IND-SMD_L7.0-W6.8]  40.89 25.54 0 top
LED2  -  [LED_0805]  25.06 22.55 90 top
LED3  -  [LED_0805]  74.55 62.61 90 top
OLED  -  [HDR-TH_4P-P2.54-V-F]  25.65 51.54 180 top
p1  -  [HDR-TH_8P-P2.54-V-M]  46.48 73.28 0 top
Q1  SS8050  [SOT-23-3_L2.9-W1.3-P1.90-LS2.4-BR]  41.78 5.21 180 top
R2  4.7K  [R0805]  33.02 60.07 180 top
R3  4.7K  [R0805]  17.65 60.07 180 top
R4  4.7K  [R0805]  17.65 63.07 180 top
R5  10K  [R0805]  58.17 9.14 270 top
R6  10K  [R0805]  66.17 9.14 270 top
R7  10K  [R0805]  30.99 9.14 270 top
R8  10K  [R0805]  22.35 9.14 270 top
R9  10K  [R0805]  22.52 22.6 90 top
R10  0.22  [R0805]  37.22 32.66 270 top
R11  200  [R0805]  35.05 26.54 270 top
R12  2K  [R0805]  51.44 27.05 0 top
R13  100kΩ  [RES-ADJ-TH_3P-L10.0-W10.0-P2.50-L]  52.44 22.87 180 top
R14  510  [R0805]  70.67 68.07 0 top
R15  10K  [R0805]  70.67 64.26 0 top
R16  10K  [R0805]  70.67 56.11 0 top
R17  510  [R0805]  70.67 60.07 0 top
R23  GL5528(10-20)  [RES-TH_L5.1-W4.3-P3.40-D0.5]  35.94 4.7 0 top
R24  1K  [R0805]  36.94 10.03 180 top
R25  1K  [R0805]  40.78 9.19 270 top
SCREW1  -  [M3螺丝]  3 72 0 top
SCREW2  -  [M3螺丝]  77 72 0 top
SCREW3  -  [M3螺丝]  3 3 0 top
SCREW4  -  [M3螺丝]  77 3 0 top
SW1  TS-1101-B-W  [KEY-SMD_2P-L6.0-W3.6-P7.4-LS8.0-L]  61.85 5.08 90 top
SW2  TS-1101-B-W  [KEY-SMD_2P-L6.0-W3.6-P7.4-LS8.0-L]  70.36 5.08 90 top
SW3  TS-1101-B-W  [KEY-SMD_2P-L6.0-W3.6-P7.4-LS8.0-L]  26.92 5.08 90 top
SW4  TS-1101-B-W  [KEY-SMD_2P-L6.0-W3.6-P7.4-LS8.0-L]  18.41 5.08 90 top
SW5  TS-1088-AR02016  [SW-SMD_L3.9-W3.0-P4.45]  77.85 62.23 90 top
U2  MPU-6050  [QFN-24_L4.0-W4.0-P0.50-BL-EP2.7]  24.71 63.87 0 top
U3  TB6612FNG  [SSOP-24_L8.3-W5.6-P0.65-LS7.6-BL]  67.31 24.51 180 bottom
U4  SS-12D10-G5  [SW-TH_SS-12D10-G050]  3.81 46.61 270 top
U5  AMS1117-3.3  [SOT-223-3_L6.5-W3.4-P2.30-LS7.0-BR]  20.23 29.98 90 top
U6  MC34063  [SOIC-8_L5.0-W4.0-P1.27-LS6.0-BL]  43.05 33.03 90 top
U7  HC-05  [BULETM-SMD_HC-05]  49.53 61.16 270 top
USB1  TYPE-C-31-M-33  [USB-C-TH_TYPE-C-31-M-33]  4.7 11.43 270 top
串口1  -  [HDR-TH_4P-P2.54-V-M]  13.59 5.46 270 top
串口2  -  [HDR-TH_4P-P2.54-V-M]  9.19 5.46 270 top
电机1  -  [HDR-TH_2P-P2.54-V-F]  70.23 44.14 90 top
电机2  -  [HDR-TH_2P-P2.54-V-F]  70.23 51.18 90 top
舵机  -  [HDR-TH_3P-P2.54-V-M]  65.89 48.89 90 top
超声波  -  [HDR-TH_4P-P2.54-V-M]  65.91 37.11 270 top

## Footprints (pads in the part's own frame, mm; a bottom-side part is the same pattern mirrored in y, then rotated)
BULETM-SMD_HC-05
  rect 1.5x1.2 smd: 1(-6.5,10) 2(-6.5,8.5) 3(-6.5,7) 4(-6.5,5.5) 5(-6.5,4) 6(-6.5,2.5) 7(-6.5,1) 8(-6.5,-0.5) 9(-6.5,-2) 10(-6.5,-3.5) 11(-6.5,-5) 12(-6.5,-6.5) 13(-6.5,-8) 22(6.5,-8) 23(6.5,-6.5) 24(6.5,-5) 25(6.5,-3.5) 26(6.5,-2) 27(6.5,-0.5) 28(6.5,1) 29(6.5,2.5) 30(6.5,4) 31(6.5,5.5) 32(6.5,7) 33(6.5,8.5) 34(6.5,10)
  rect 1.2x1.5 smd: 14(-5.25,-10) 15(-3.75,-10) 16(-2.25,-10) 17(-0.75,-10) 18(0.75,-10) 19(2.25,-10) 20(3.75,-10) 21(5.25,-10)
BUZ-TH_BD12.0-P7.60-D0.6-FD
  round 1.8 hole 1: 1(-3.8,0) 2(3.8,0)
C0805
  rect 1.41x1.35 smd: 1(-1,0) 2(1,0)
CAP-SMD_BD6.3-L6.6-W6.6-LS7.6-RD
  rect 3.5x1.2 smd: 1(-2.67,0) 2(2.67,0)
CAP-SMD_L3.2-W1.6
  rect 1.2x1.4 smd: 1(-1.35,0) 2(1.35,0)
CAP-SMD_L3.5-W2.8-R-RD
  rect 1.9x2.376 smd: 1(1.899,0) 2(-1.899,0)
CONN-TH_8P-P2.54_HCTL_XH-8AW_C2908617
  rect 1.8x1.8 hole 1: 1(-8.89,0)
  round 1.8 hole 1: 2(-6.35,0) 3(-3.81,0) 4(-1.27,0) 5(1.27,0) 6(3.81,0) 7(6.35,0) 8(8.89,0)
CONN-TH_P5.00_KF235-5.0-2P
  round 2.2 hole 1.5: 1(-2.5,2.5) 2(2.5,2.5) 2(2.5,-2.5)
  rect 2.2x2.2 hole 1.5: 1(-2.5,-2.5)
DC-IN-TH_KH-DC-005-2.5
  oval 1.5x4.2 hole 0.9x3.5: 1(3,2.35)
  oval 1.5x4 hole 0.9x3.3: 2(-3,2.35)
  oval 4x1.5 hole 3.3x0.9: 3(0.2,-2.35)
HDR-TH_2P-P2.54-V-F
  rect 1.7x1.7 hole 1: 1(-1.27,0)
  round 1.7 hole 1: 2(1.27,0)
HDR-TH_3P-P2.54-V-M
  rect 1.7x1.7 hole 1.1: 1(-2.54,0)
  round 1.7 hole 1.1: 2(0,0) 3(2.54,0)
HDR-TH_4P-P2.54-V-F
  rect 1.7x1.7 hole 1.1: 1(-3.81,0)
  round 1.7 hole 1.1: 2(-1.27,0) 3(1.27,0) 4(3.81,0)
HDR-TH_4P-P2.54-V-M
  rect 1.7x1.7 hole 1.1: 1(-3.81,0)
  round 1.7 hole 1.1: 2(-1.27,0) 3(1.27,0) 4(3.81,0)
HDR-TH_6P-P2.54-V-M-1
  rect 1.8x1.8 hole 1.2: 1(-6.35,0)
  round 1.8 hole 1.2: 2(-3.81,0) 3(-1.27,0) 4(1.27,0) 5(3.81,0) 6(6.35,0)
HDR-TH_8P-P2.54-V-M
  rect 1.5x1.5 hole 1: 1(-8.89,0)
  round 1.5 hole 1: 2(-6.35,0) 3(-3.81,0) 4(-1.27,0) 5(1.27,0) 6(3.81,0) 7(6.35,0) 8(8.89,0)
HDR-TH_12P-P2.54-V-M-R2-C6-S2.54
  rect 1.7x1.7 hole 1.1: 1(-6.35,-1.27)
  round 1.7 hole 1.1: 2(-6.35,1.27) 3(-3.81,-1.27) 4(-3.81,1.27) 5(-1.27,-1.27) 6(-1.27,1.27) 7(1.27,-1.27) 8(1.27,1.27) 9(3.81,-1.27) 10(3.81,1.27) 11(6.35,-1.27) 12(6.35,1.27)
HDR-TH_20P-P2.54-V-F
  rect 1.8x1.8 hole 1.2: 1(-24.13,0)
  round 1.8 hole 1.2: 2(-21.59,0) 3(-19.05,0) 4(-16.51,0) 5(-13.97,0) 6(-11.43,0) 7(-8.89,0) 8(-6.35,0) 9(-3.81,0) 10(-1.27,0) 11(1.27,0) 12(3.81,0) 13(6.35,0) 14(8.89,0) 15(11.43,0) 16(13.97,0) 17(16.51,0) 18(19.05,0) 19(21.59,0) 20(24.13,0)
HDR-TH_20P-P2.54-V-M-1
  rect 1.8x1.8 hole 1.2: 1(-24.13,0)
  round 1.8 hole 1.2: 2(-21.59,0) 3(-19.05,0) 4(-16.51,0) 5(-13.97,0) 6(-11.43,0) 7(-8.89,0) 8(-6.35,0) 9(-3.81,0) 10(-1.27,0) 11(1.27,0) 12(3.81,0) 13(6.35,0) 14(8.89,0) 15(11.43,0) 16(13.97,0) 17(16.51,0) 18(19.05,0) 19(21.59,0) 20(24.13,0)
IND-SMD_L7.0-W6.8
  rect 1.9x2.4 smd: 1(3.048,0) 2(-3.048,0)
KEY-SMD_2P-L6.0-W3.6-P7.4-LS8.0-L
  rect 1.2x1 smd: 1(-3.7,0) 2(3.7,0)
LED_0805
  rect 1x1.25 smd: 1(-1.15,0.005) 2(1.05,0.005)
M3螺丝
  round 3.2 hole 3.2: 1(0,0)
QFN-24_L4.0-W4.0-P0.50-BL-EP2.7
  oval 0.28x0.8 smd: 1(-1.25,-2) 2(-0.75,-2) 3(-0.25,-2) 4(0.25,-2) 5(0.75,-2) 6(1.25,-2) 13(1.25,2) 14(0.75,2) 15(0.25,2) 16(-0.25,2) 17(-0.75,2) 18(-1.242,2)
  oval 0.8x0.28 smd: 7(2,-1.25) 8(2,-0.75) 9(2,-0.25) 10(2,0.25) 11(2,0.75) 12(2,1.25) 19(-2,1.25) 20(-2,0.75) 21(-2,0.25) 22(-2,-0.25) 23(-2,-0.75) 24(-2,-1.25)
  rect 2.7x2.7 smd: 25(0.013,0)
R0805
  rect 1.133x1.377 smd: 1(-1,0) 2(1,0)
RES-ADJ-TH_3P-L10.0-W10.0-P2.50-L
  round 1.524 hole 0.762: 1(-2.5,0) 2(0,0) 3(2.5,0)
RES-TH_L5.1-W4.3-P3.40-D0.5
  round 1.524 hole 0.762: 1(0,1.7) 2(0,-1.7)
SMA_L4.3-W2.5-LS5.0-RD
  rect 2x1.593 smd: 1(-2.1,0) 2(2.1,0)
SOIC-8_L5.0-W4.0-P1.27-LS6.0-BL
  oval 0.569x1.95 smd: 1(-1.905,-2.705) 2(-0.635,-2.705) 3(0.635,-2.705) 4(1.905,-2.705) 5(1.905,2.705) 6(0.635,2.705) 7(-0.635,2.705) 8(-1.905,2.705)
SOT-23-3_L2.9-W1.3-P1.90-LS2.4-BR
  rect 1.25x0.7 smd: 1(1,-0.95) 2(1,0.95) 3(-1,0)
SOT-223-3_L6.5-W3.4-P2.30-LS7.0-BR
  rect 2.5x1.1 smd: 1(2.97,-2.3) 2(2.97,0) 3(2.97,2.3)
  rect 2.34x3.6 smd: 4(-2.97,0)
SSOP-24_L8.3-W5.6-P0.65-LS7.6-BL
  oval 0.308x1.324 smd: 1(-3.575,-3.562) 2(-2.925,-3.562) 3(-2.275,-3.562) 4(-1.625,-3.562) 5(-0.975,-3.562) 6(-0.325,-3.562) 7(0.325,-3.562) 8(0.975,-3.562) 9(1.625,-3.562) 10(2.275,-3.562) 11(2.925,-3.562) 12(3.575,-3.562) 13(3.575,3.562) 14(2.925,3.562) 15(2.275,3.562) 16(1.625,3.562) 17(0.975,3.562) 18(0.325,3.562) 19(-0.325,3.562) 20(-0.975,3.562) 21(-1.625,3.562) 22(-2.275,3.562) 23(-2.925,3.562) 24(-3.575,3.562)
SW-SMD_L3.9-W3.0-P4.45
  rect 1.23x1.36 smd: 1(-2.185,0) 2(2.185,0)
SW-TH_SS-12D10-G050
  oval 1.8x3 hole 1.1x2.3: 1(-4.7,0) 2(0,0) 3(4.7,0)
USB-C-TH_TYPE-C-31-M-33
  oval 1.1x1.8 hole 0.6x1.3: 3(4.32,1.8) 6(-4.32,1.8)
  oval 1.1x2.7 hole 0.6x2.2: 4(4.32,-2.15) 5(-4.32,-2.15)
  round 1.1 hole 0.8: A9(1.52,2.15) B12(-1.52,2.15)

## Nets
As in the schematic.

Pads without a net: R13 3; SCREW1 1; SCREW2 1; SCREW3 1; SCREW4 1; U2 2 3 4 5 14 15 16 17 19 21 22; U4 3; U7 3 4 5 6 7 8 9 10 11 14 15 16 17 18 19 20 22 23 24 25 26 27 28 29 30 33; USB1 3 4 5 6

## Via types
v1: diameter 0.61, hole 0.305, Top Layer to Bottom Layer, 104 vias

## Routing (per net, layer and track width the routed paths; a pad name or vN(x,y) marks a point on that pad's centre or on a via; arc(x,y) is an arc through that point)
3V3: length 288.3
  Top Layer w0.406: 28.96,58.29 28.96,62.61 28.45,63.12 U2.8
  Top Layer w0.508: 43.16,67.71 43.16,66.57 44.07,65.66 63.68,65.66 64.77,66.75 64.77,69.6 65.28,70.1 68.84,70.1 ; 56,10.19 56,7.37 BUZZER1.1 51.63,3 R23.2 34.97,3 34.29,3.68 34.29,9.53 33.67,10.14 R7.1 R8.1 16.32,10.14 15.34,11.12 12.34,11.12 11.52,11.95 11.52,26.4 12.12,27 12.83,27 ; 56,10.19 66.12,10.19 R6.1 ; 56,10.19 H2.3 H9.18 ; 7.84,63.07 7.87,63.04 7.87,60.71 7.11,59.94 H8.8 ; 7.84,63.07 4.78,63.07 H8.6 ; 7.84,63.07 C6.1 ; 26.92,58.29 26.92,58.28 OLED.2 ; 26.92,58.29 36.98,58.29 37.59,58.9 37.59,68.48 38.3,69.19 42.49,69.19 43.03,68.65 U7.12 ; 26.92,58.29 17.3,58.29 16.65,58.94 R3.2 R4.2 C6.1 ; 12.83,27 12.83,43.76 H10.1 H3.1 ; 12.83,27 12.84,26.99 20.21,26.99 U5.4 ; C6.1 13.46,66.75 14.22,67.51 25.5,67.51 25.96,67.06 25.96,66.45 ; U5.2 U5.4 ; U5.4 C15.2 C16.2 R9.1 ; 68.84,70.1 68.83,70.11 H1.5 ; 68.84,70.1 74.12,70.1 75.49,68.73 75.49,65.18 76.25,64.42 SW5.2
  Bottom Layer w0.508: H3.1 12.82,48.79 13.67,49.63 26.35,49.63 26.36,49.63 26.92,50.19 OLED.2
12V: length 167
  Top Layer w0.762: D1.1 59.06,30.56 C21.1 ; 59.06,23.62 58.3,22.87 R13.1 ; 59.06,23.62 59.06,23.09 ; 59.06,23.62 C21.1 ; v1(67.94,53.37) 67.92,53.39 60.36,53.39 60.35,53.38 40.71,53.38 40.7,53.39 v1(31.47,53.39) ; C21.1 59.18,27.18 v1(64.02,27.18) ; 59.11,30.51 59.18,30.59 v1(70.88,30.59)
  Bottom Layer w0.635: U3.24 v1(70.88,30.59)
  Bottom Layer w0.762: 11.68,65.02 11.68,66.73 10.85,67.56 H8.2 ; 11.68,65.02 H8.4 ; 11.68,65.02 11.68,55.17 13.46,53.39 v1(31.47,53.39) ; 71.64,37.08 68.66,37.08 67.94,37.8 v1(67.94,53.37) ; R13.1 61,22.87 62.1,21.78 62.1,18.78 63.34,17.53 67.93,17.53 ; v1(70.88,30.59) 71.81,31.51 71.81,37.2 73.09,38.48 CN2.1
+5V: length 274.1
  Top Layer w0.508: 10.51,51.31 7.97,51.31 ; 10.51,51.31 17.27,51.31 17.91,50.67 17.91,47.77 H3.3 H10.3 17.93,43.73 17.93,40.95 18,40.88 C20.2 36.64,40.88 37.21,40.31 37.21,33.67 R10.1 U6.6 ; 10.51,51.31 10.51,1.65 ; 7.97,51.31 7.87,51.41 7.87,54.78 ; 7.97,51.31 U4.1 ; 7.87,54.78 7.79,54.86 H8.12 ; 7.87,54.78 7.87,56.41 6.88,57.4 H8.10 ; 10.51,1.65 串口1.4 ; 10.51,1.65 9.65,1.65 ; v1(63.18,38.27) 63.14,38.23 C19.1 ; 67.96,41.02 66.01,41.02 超声波.1 ; 67.96,41.02 67.96,48.17 67.23,48.89 舵机.2 ; 67.96,41.02 CN2.2 ; 17.9,32.95 17.9,40.95
  Bottom Layer w0.508: H8.10 3.78,57.4 2.94,58.25 2.94,68.31 3.53,68.91 7.43,68.91 7.87,69.35 7.87,72.19 8.99,73.3 37.57,73.3 p1.1 ; 76.25,25.53 76.25,40.23 75.46,41.02 CN2.2 ; 76.25,25.53 76.25,13.82 75.74,13.31 73.35,13.31 72.8,13.87 72.8,17.07 72.35,17.51 C12.1 ; 76.25,25.53 CN3.5 68.45,25.53 67.92,26.06 67.92,27.48 ; v1(63.18,38.27) 63.18,40.02 63.93,40.77 65.76,40.77 超声波.1
GND: length 29.4
  Top Layer w0.254: v1(43.62,32.37) 45.73,32.37 U6.2 ; U2.1 23.46,62.61 U2.25 ; C5.1 C4.2 30.25,64.62 U2.11 25.47,64.62 U2.25 ; U2.18 23.47,65.12 U2.25 ; U5.1 22.53,29.89 v1(22.56,29.87) ; U6.4 v1(43.62,34.93)
  Bottom Layer w0.254: U3.9 65.69,22.24 v1(65.35,22.57) 65.03,22.25 U3.10 ; U3.18 v1(66.99,25.48)
  vias: v1(14.38,71.25) v1(14.38,68.93) v1(14.38,56.25) v1(14.38,54.58) v1(15.06,36.22) v1(15.11,32.41) v1(15.11,28.68) v1(16.6,56.25) v1(16.61,54.58) v1(18.99,71.25) v1(19.04,68.93) v1(19.53,56.25) v1(20.02,54.58) v1(23.01,54.58) v1(24.02,71.25) v1(24.02,68.93) v1(24.99,32.92) v1(24.99,29.44) v1(27.9,22.48) v1(28.17,32.92) v1(28.17,29.49) v1(29.62,22.48) v1(31.85,22.48) v1(33.58,51.21) v1(35.35,51.21) v1(38.76,37.06) v1(39.6,1.09) v1(40.92,40.92) v1(41.83,37.06) v1(41.79,1.09) v1(42.42,63.09) v1(42.42,60.1) v1(43.43,51.21) v1(43.41,40.92) v1(44.7,10.06) v1(45.19,37.06) v1(45.21,1.09) v1(45.41,51.21) v1(45.75,60.1) v1(45.76,63.09) v1(46.02,40.92) v1(46.66,29.29) v1(46.66,27.18) v1(48.35,1.09) v1(48.41,37.06) v1(48.64,63.09) v1(48.6,60.1) v1(48.95,40.92) v1(50.98,69.37) v1(51.69,51.21) v1(51.84,63.09) v1(51.84,60.1) v1(52.07,37.06) v1(52.25,40.92) v1(52.22,1.09) v1(53.47,70.69) v1(53.47,69.42) v1(54.9,40.92) v1(55.02,37.06) v1(55.65,1.09) v1(55.96,70.69) v1(55.97,69.42) v1(57.17,40.92) v1(57.4,37.06) v1(58.58,70.69) v1(59.26,61.46) v1(59.26,57.89) v1(59.87,40.92) v1(60.32,37.06) v1(62.48,40.92) v1(64.72,43.05) v1(66.58,43.05) v1(67.77,66.47) v1(70.19,66.47) v1(76.23,9.14) v1(76.23,7.14) v1(78.16,66.5)
VBAT: length 4
  Top Layer w0.508: H9.1 H2.20
AD0: length 43.5
  Top Layer w0.254: p1.7 52.83,71.75 52.07,70.99 36.83,70.99 36.19,70.36 36.19,59.56 35.43,58.8 32.64,58.8 32.02,59.42 R2.2 31.05,60.07 30.8,60.33 30.8,63.44 30.62,63.62 U2.9
AM1: length 53.3
  Top Layer w0.508: v1(70.56,19.63) 70.56,14.4 71.25,13.72 75.18,13.72 75.82,14.35 75.82,45.34 75.06,46.1 CN2.4 73.13,46.1 72.42,45.39 72.42,43.56 71.7,42.85 70.26,42.85 电机1.1
  Bottom Layer w0.508: U3.2 70.24,19.95 v1(70.56,19.63) 70.88,19.95 U3.1
AM2: length 62.7
  Top Layer w0.508: 70.23,45.42 70.23,47.88 70.99,48.64 CN2.5 76.2,48.64 76.84,48.01 76.84,13.33 76.33,12.83 68.58,12.83 67.95,13.46 67.95,19.5
  Bottom Layer w0.508: U3.6 67.63,19.94 67.97,19.61 68.28,19.92 U3.5
  vias: v1(67.95,19.63)
BLE_EN: length 25.9
  Top Layer w0.254: H1.6 71.37,71.27 71.88,70.76 74.88,70.76 76.28,69.37 76.28,66.07 76.81,65.53 78.64,65.53 79.1,65.08 79.1,60.45 78.69,60.05 SW5.1 77.82,60.07 72.23,60.07
BLE_STATE: length 26.3
  Top Layer w0.254: v1(73,64.26) R15.2
  Bottom Layer w0.254: H1.1 59.95,74.57 72.61,74.57 73,74.18 73,64.27 v1(73,64.26)
BM1: length 76.4
  Top Layer w0.508: 电机2.2 71.5,53.72 CN2.7 77.98,53.72 78.99,52.7 78.99,11.81 78.49,11.3 64.59,11.3 64.08,11.81 64.08,19.37
  Bottom Layer w0.508: U3.11 64.38,19.94 64.08,19.63 63.74,19.98 U3.12
  vias: v1(64.08,19.63)
BM2: length 68.6
  Top Layer w0.508: 66.65,19.5 66.65,12.6 67.17,12.08 77.6,12.08 78.1,12.58 78.1,50.42 77.11,51.41 71.86,51.41 70.36,49.91 电机2.1
  Bottom Layer w0.508: U3.7 66.99,19.89 66.65,19.56 66.34,19.87 U3.8
  vias: v1(66.65,19.63)
INT: length 37.6
  Top Layer w0.254: U2.12 27.22,65.12 27.48,65.37 27.48,73.45 28.32,74.3 36.71,74.3 36.73,74.31 53.26,74.31 53.27,74.3 54.36,74.3 p1.8
NRST: length 4
  Top Layer w0.254: H9.17 H2.4
OSC32_IN: length 4
  Top Layer w0.254: H9.3 H2.18
OSC32_OUT: length 4
  Top Layer w0.254: H9.4 H2.17
PA0: length 23.6
  Top Layer w0.254: R23.1 R24.2 35.94,11.3 35.43,11.81 23.75,11.81 22.98,12.58 H2.16 H9.5
PA1: length 19.3
  Top Layer w0.254: H9.6 H2.15
  Bottom Layer w0.254: H2.15 24.08,12.32 14.1,12.32 13.59,11.81 13.59,9.27
PA2: length 24.3
  Top Layer w0.254: H9.7 H2.14
  Bottom Layer w0.254: H2.14 28.06,12.44 27.43,11.81 16.13,11.81 15.37,11.05 15.37,7.37 14.73,6.73 串口1.2
PA3: length 75.6
  Top Layer w0.254: 65.89,46.36 65.82,46.28 63.81,46.28 63.06,47.03 63.06,49.19 62.55,49.7 v1(29.46,49.7) ; H9.8 H2.13
  Bottom Layer w0.254: H9.8 30.6,41.64 29.36,42.88 29.36,49.6 v1(29.46,49.7)
PA4: length 14.1
  Top Layer w0.254: R25.1 40.77,10.21 40.77,11.81 40.26,12.32 34.59,12.32 H2.12 H9.9
PA5: length 4
  Top Layer w0.254: H9.10 H2.11
PA6: length 106.1
  Top Layer w0.254: 超声波.2 65.94,38.41 v1(69.11,38.41) ; H9.11 H2.10
  Bottom Layer w0.254: H2.10 38.22,3.54 39.12,2.64 72.34,2.64 73.35,3.66 73.35,11.33 74.17,12.14 76.81,12.14 77.42,12.75 77.42,41.55 76.77,42.2 72.12,42.2 71.43,41.5 69.7,41.5 69.11,40.92 v1(69.11,38.41)
PA7: length 50.2
  Top Layer w0.254: H9.12 H2.9 ; 超声波.3 64.77,35.84 64.21,35.28 64.21,33.27 63.78,32.84 51.84,32.84 51.38,32.39 v1(51.38,28.52)
  Bottom Layer w0.254: H2.9 42.01,15.01 51.26,15.01 52.1,15.85 52.1,17.27 52.1,17.27 52.1,18.25 52.1,18.26 52.1,19.76 51.38,20.47 v1(51.38,28.52)
PA8: length 55.5
  Top Layer w0.254: H3.16 H10.16
  Bottom Layer w0.254: H10.16 50.92,29.59 51.18,29.34 64.82,29.34 65.03,29.12 U3.15 65.03,23.38 64.56,22.91 63.34,22.91 63.02,22.58 63.02,19.46 63.5,18.97 73.1,18.97 CN3.2
PA9/USART1_TX: length 53.3
  Top Layer w0.254: H1.3 63.75,69.47 63.37,69.09 59.94,69.09 59.66,68.8 59.66,67.71 ; H3.15 H10.15
  Bottom Layer w0.254: H1.3 63.75,50.43 63.03,49.7 49.15,49.7 48.38,48.93 H3.15
PA10/USART1_RX: length 52.1
  Top Layer w0.254: 58.16,67.71 58.16,69.21 58.55,69.6 60.83,69.6 61.21,69.98 H1.2 ; H3.14 H10.14
  Bottom Layer w0.254: H3.14 45.84,49.74 46.7,50.6 60.4,50.6 61.2,51.4 61.2,73.29 H1.2
PA15: length 55.1
  Top Layer w0.254: H3.11 H10.11 38.22,40.29 38.81,39.7 69.88,39.7 70.23,39.34 v1(70.23,33.15) CN3.8
  Bottom Layer w0.254: v1(70.23,33.15) 70.23,28.08 U3.23
PB0: length 37.3
  Top Layer w0.254: SW1.2 61.21,8.14 R5.2 C8.2 58.14,3.56 v1(56.77,3.56) ; H9.13 H2.8
  Bottom Layer w0.254: v1(56.77,3.56) 43.81,3.56 43.3,4.07 H2.8
PB1: length 38.3
  Top Layer w0.254: H9.14 H2.7 ; R6.2 66.17,3.92 ; R6.2 66.15,8.13 v1(64.52,8.13) ; R6.2 69.72,8.14 SW2.2
  Bottom Layer w0.254: H2.7 45.84,8.64 46.35,8.13 v1(64.52,8.13)
PB3: length 56.6
  Top Layer w0.254: v1(32.51,3.56) 31.02,3.56 C10.2 R7.2 27.56,8.14 SW3.2 ; H3.10 H10.10
  Bottom Layer w0.254: v1(32.51,3.56) 33.66,3.56 34.42,4.32 34.42,19.18 35.69,20.45 35.69,20.7 35.68,20.71 H10.10
PB4: length 58.1
  Top Layer w0.254: SW4.2 19.05,8.14 R8.2 ; R8.2 22.37,8.13 v1(23.62,8.13) ; R8.2 C11.2 ; H3.9 H10.9
  Bottom Layer w0.254: H10.9 33.14,20.57 31.96,19.39 31.96,8.85 31.24,8.13 v1(23.62,8.13)
PB5: length 4
  Top Layer w0.254: H3.8 H10.8
PB6: length 58.4
  Top Layer w0.254: H3.7 H10.7
  Bottom Layer w0.254: H10.7 28.06,42.54 27.43,41.91 11.68,41.91 11.18,41.4 11.18,7.37 10.54,6.73 9.65,6.73
PB7: length 53.1
  Top Layer w0.254: H3.6 H10.6
  Bottom Layer w0.254: H10.6 25.52,43.17 24.89,42.55 11.18,42.55 10.54,41.91 10.54,10.16 9.65,9.27
PB8: length 8.4
  Top Layer w0.254: OLED.3 22.99,50.14 22.99,47.77 H3.5 H10.5
PB9: length 8.4
  Top Layer w0.254: H10.4 H3.4 20.45,47.77 20.45,50.14 OLED.4
PB10: length 113.5
  Top Layer w0.254: U2.23 v1(20.47,63.12) 18.7,63.12 ; H9.15 H2.6
  Bottom Layer w0.254: p1.3 42.67,71.12 42.04,70.48 37.21,70.48 36.58,69.85 36.58,61.21 36.07,60.71 20.5,60.71 20.47,60.68 ; 20.47,60.68 v1(20.47,63.12) ; 20.47,60.68 20.47,56.49 21.21,55.75 36.22,55.75 36.93,55.04 36.93,20.27 37.74,19.46 47.96,19.46 48.36,19.05 48.36,17.78 H9.15
PB11: length 116.8
  Top Layer w0.254: H9.16 H2.5 ; U2.24 21.85,62.62 21.46,62.23 v1(21.46,60.02) 21.38,60.02 21.34,60.07 18.65,60.07
  Bottom Layer w0.254: p1.4 45.21,70.36 44.7,69.85 37.72,69.85 37.21,69.34 37.21,60.58 36.7,60.07 21.51,60.07 v1(21.46,60.02) 21.46,57 22.07,56.39 38.84,56.39 39.4,55.82 39.4,43.27 39.37,43.24 39.37,21.08 40.13,20.32 50.29,20.32 50.93,19.69 50.93,19.43 50.92,19.43 H9.16
PB12: length 36.8
  Top Layer w0.254: H3.20 H10.20
  Bottom Layer w0.254: H10.20 61.08,32.49 61.62,31.95 68.88,31.95 69.54,31.29 69.54,28.11 U3.22 69.6,28.06 69.6,26.87 69.85,26.62 72.19,26.62 72.59,27.03 72.59,30.07 73.13,30.61 CN3.7
PB13: length 37.9
  Top Layer w0.254: H3.19 H10.19
  Bottom Layer w0.254: H10.19 58.54,31.58 59.03,31.09 68.43,31.09 68.88,30.63 68.88,28.9 68.91,28.88 68.91,28.1 U3.21 68.94,26.52 69.24,26.21 72.75,26.21 73.05,26.52 73.05,27.69 73.43,28.07 CN3.6
PB14: length 41.9
  Top Layer w0.254: H3.18 H10.18
  Bottom Layer w0.254: CN3.4 73.78,23.38 66.59,23.38 66.34,23.63 U3.17 66.34,28.08 66.34,29.97 65.89,30.43 56.74,30.43 56,31.17 H10.18
PB15: length 46.8
  Top Layer w0.254: H3.17 H10.17
  Bottom Layer w0.254: H10.17 53.46,30.36 53.9,29.92 65.2,29.92 65.69,29.44 U3.16 65.69,23.42 66.17,22.94 72.34,22.94 72.75,22.53 72.75,20.78 73.08,20.45 CN3.3
PC13: length 4
  Top Layer w0.254: H9.2 H2.19
USB_D+_PA12: length 4
  Top Layer w0.254: H3.12 H10.12
USB_D-_PA11: length 4
  Top Layer w0.254: H3.13 H10.13
XCL: length 35.6
  Top Layer w0.254: v1(28.12,62.31) 27.81,62.62 U2.7
  Bottom Layer w0.254: v1(28.12,62.31) 28.12,71.55 28.63,72.06 40.89,72.06 41.4,72.57 41.4,73.86 41.86,74.32 49.81,74.32 50.29,73.84 p1.6
XDA: length 37.2
  Top Layer w0.254: U2.6 v1(25.96,59.33)
  Bottom Layer w0.254: p1.5 47.75,69.72 47.24,69.22 38.61,69.22 37.97,68.58 37.97,59.94 37.36,59.33 v1(25.96,59.33)
$1N1884: length 7.9
  Top Layer w0.254: U2.10 C4.1 34.63,64.12
$1N2034: length 4.6
  Top Layer w0.254: 18.65,65.91 19.95,64.62 U2.20
$3N336: length 3.5
  Top Layer w0.254: Q1.3 BUZZER1.2
$3N347: length 2
  Top Layer w0.254: R25.2 Q1.1
$4N708: length 5
  Bottom Layer w0.254: C14.2 71,13.72 71.5,14.22 71.5,15.47
$6N494: length 49.8
  Bottom Layer w0.508: USB1.A9 9.35,12.41 9.35,22.54 9.27,22.62 9.27,31.38 ; CN1.2 CN1.2 9.25,31.41 9.27,31.38 ; 9.27,31.38 9.27,45.97 8.64,46.61 U4.2
$7N512: length 2.5
  Top Layer w0.508: R9.2 LED2.2
$7N1414: length 16.8
  Top Layer w0.508: L1.2 R11.2 34.15,25.54 33.53,26.16 33.53,30.99 34.2,31.66 R10.2 37.38,31.66 38.11,32.39 U6.7
$7N1427: length 7.9
  Top Layer w0.508: R11.1 35.05,29.46 35.94,30.35 37.85,30.35 38.62,31.12 U6.8
$7N1439: length 10.8
  Top Layer w0.762: L1.1 43.94,30.61 44.46,31.12 U6.1 49.46,31.12
$7N1530: length 4.9
  Top Layer w0.762: U6.3 49.8,33.66 C23.1
$7N1822: length 29.7
  Top Layer w0.762: U6.5 41.27,34.93 42.04,34.16 42.04,22.35 43.05,21.34 51.31,21.34 52.44,22.46 R13.2 R12.2
$8N873: length 15.1
  Top Layer w0.254: R17.1 R16.1 69.67,55.19 69.19,54.71 59.66,54.71 59.66,54.71
$8N886: length 22.3
  Top Layer w0.254: R15.1 57.15,64.26 56.64,63.75 56.64,54.73 56.66,54.71
$8N895: length 26.6
  Top Layer w0.254: 55.16,54.71 55.17,54.73 55.17,64.21 55.98,65.02 64.82,65.02 65.58,65.79 65.58,67.41 66.24,68.07 R14.1
$8N949: length 6.8
  Top Layer w0.254: LED3.2 74.54,67.34 73.75,68.07 R14.2

## Copper pours and planes (outline as drawn; the poured copper is in the pictures)
12V on Top Layer: 52.63,31.44 55.68,31.44 55.68,29.67 52.63,29.67
12V on Bottom Layer: 63.45,28.8 64.59,28.8 64.59,26.9 63.45,26.9
+5V on Bottom Layer: 67.41,28.8 68.48,28.8 68.48,27.23 67.41,27.23
GND on Top Layer: -20.88,88.29 127.1,88.29 127.1,-43.97 -20.88,-43.97
GND on Bottom Layer: -11.79,84.43 93.22,84.43 93.22,-12.83 -11.79,-12.83

Small or netless copper shapes (teardrops, artwork), in the pictures only: 1 on Top Layer

## Text on the board
Top Silkscreen Layer: VBAT | 3V3 | PC13 | GND | OSC32_IN | +5V | PB9 | OUT | SDA | PB8 | PA0 | SCL | PA1 | PB7 | 3v3 | PA2 | PB6 | PA3 | PB5 | PA4 | PB4 | PA5 | PB3 | PA15 | PA6 | USB_D+ | PA12 | PA7 | USB_D- | PA11 | PB0 | PA10 | PB1 | RX | XDA | PB10 | PA9 | TX | XCL | PB11 | PA8 | AD0 | PB15 | NRST | INT | PB14 | PB13 | PB12 | 12V | Echo | Trig | AM1 | BM1 | BM2 | AM2
